# EasyEDA Pro project board.epro, schematic 黄山派核心板_SCH_V1.2

## Sheets
1 SF32LB52-MOD-1: Board Name: 核心板; Create Date: 2025-04-18; Page Name: SF32LB52-MOD-1; Project Name: 立创·黄山派SF32LB52开发板V1.3（202504182008）; Schematic Name: 黄山派核心板_SCH_V1.3; Update Date: 2025-04-18; Company: 嘉立创EDA; Page Size: A3; Version: V1.0
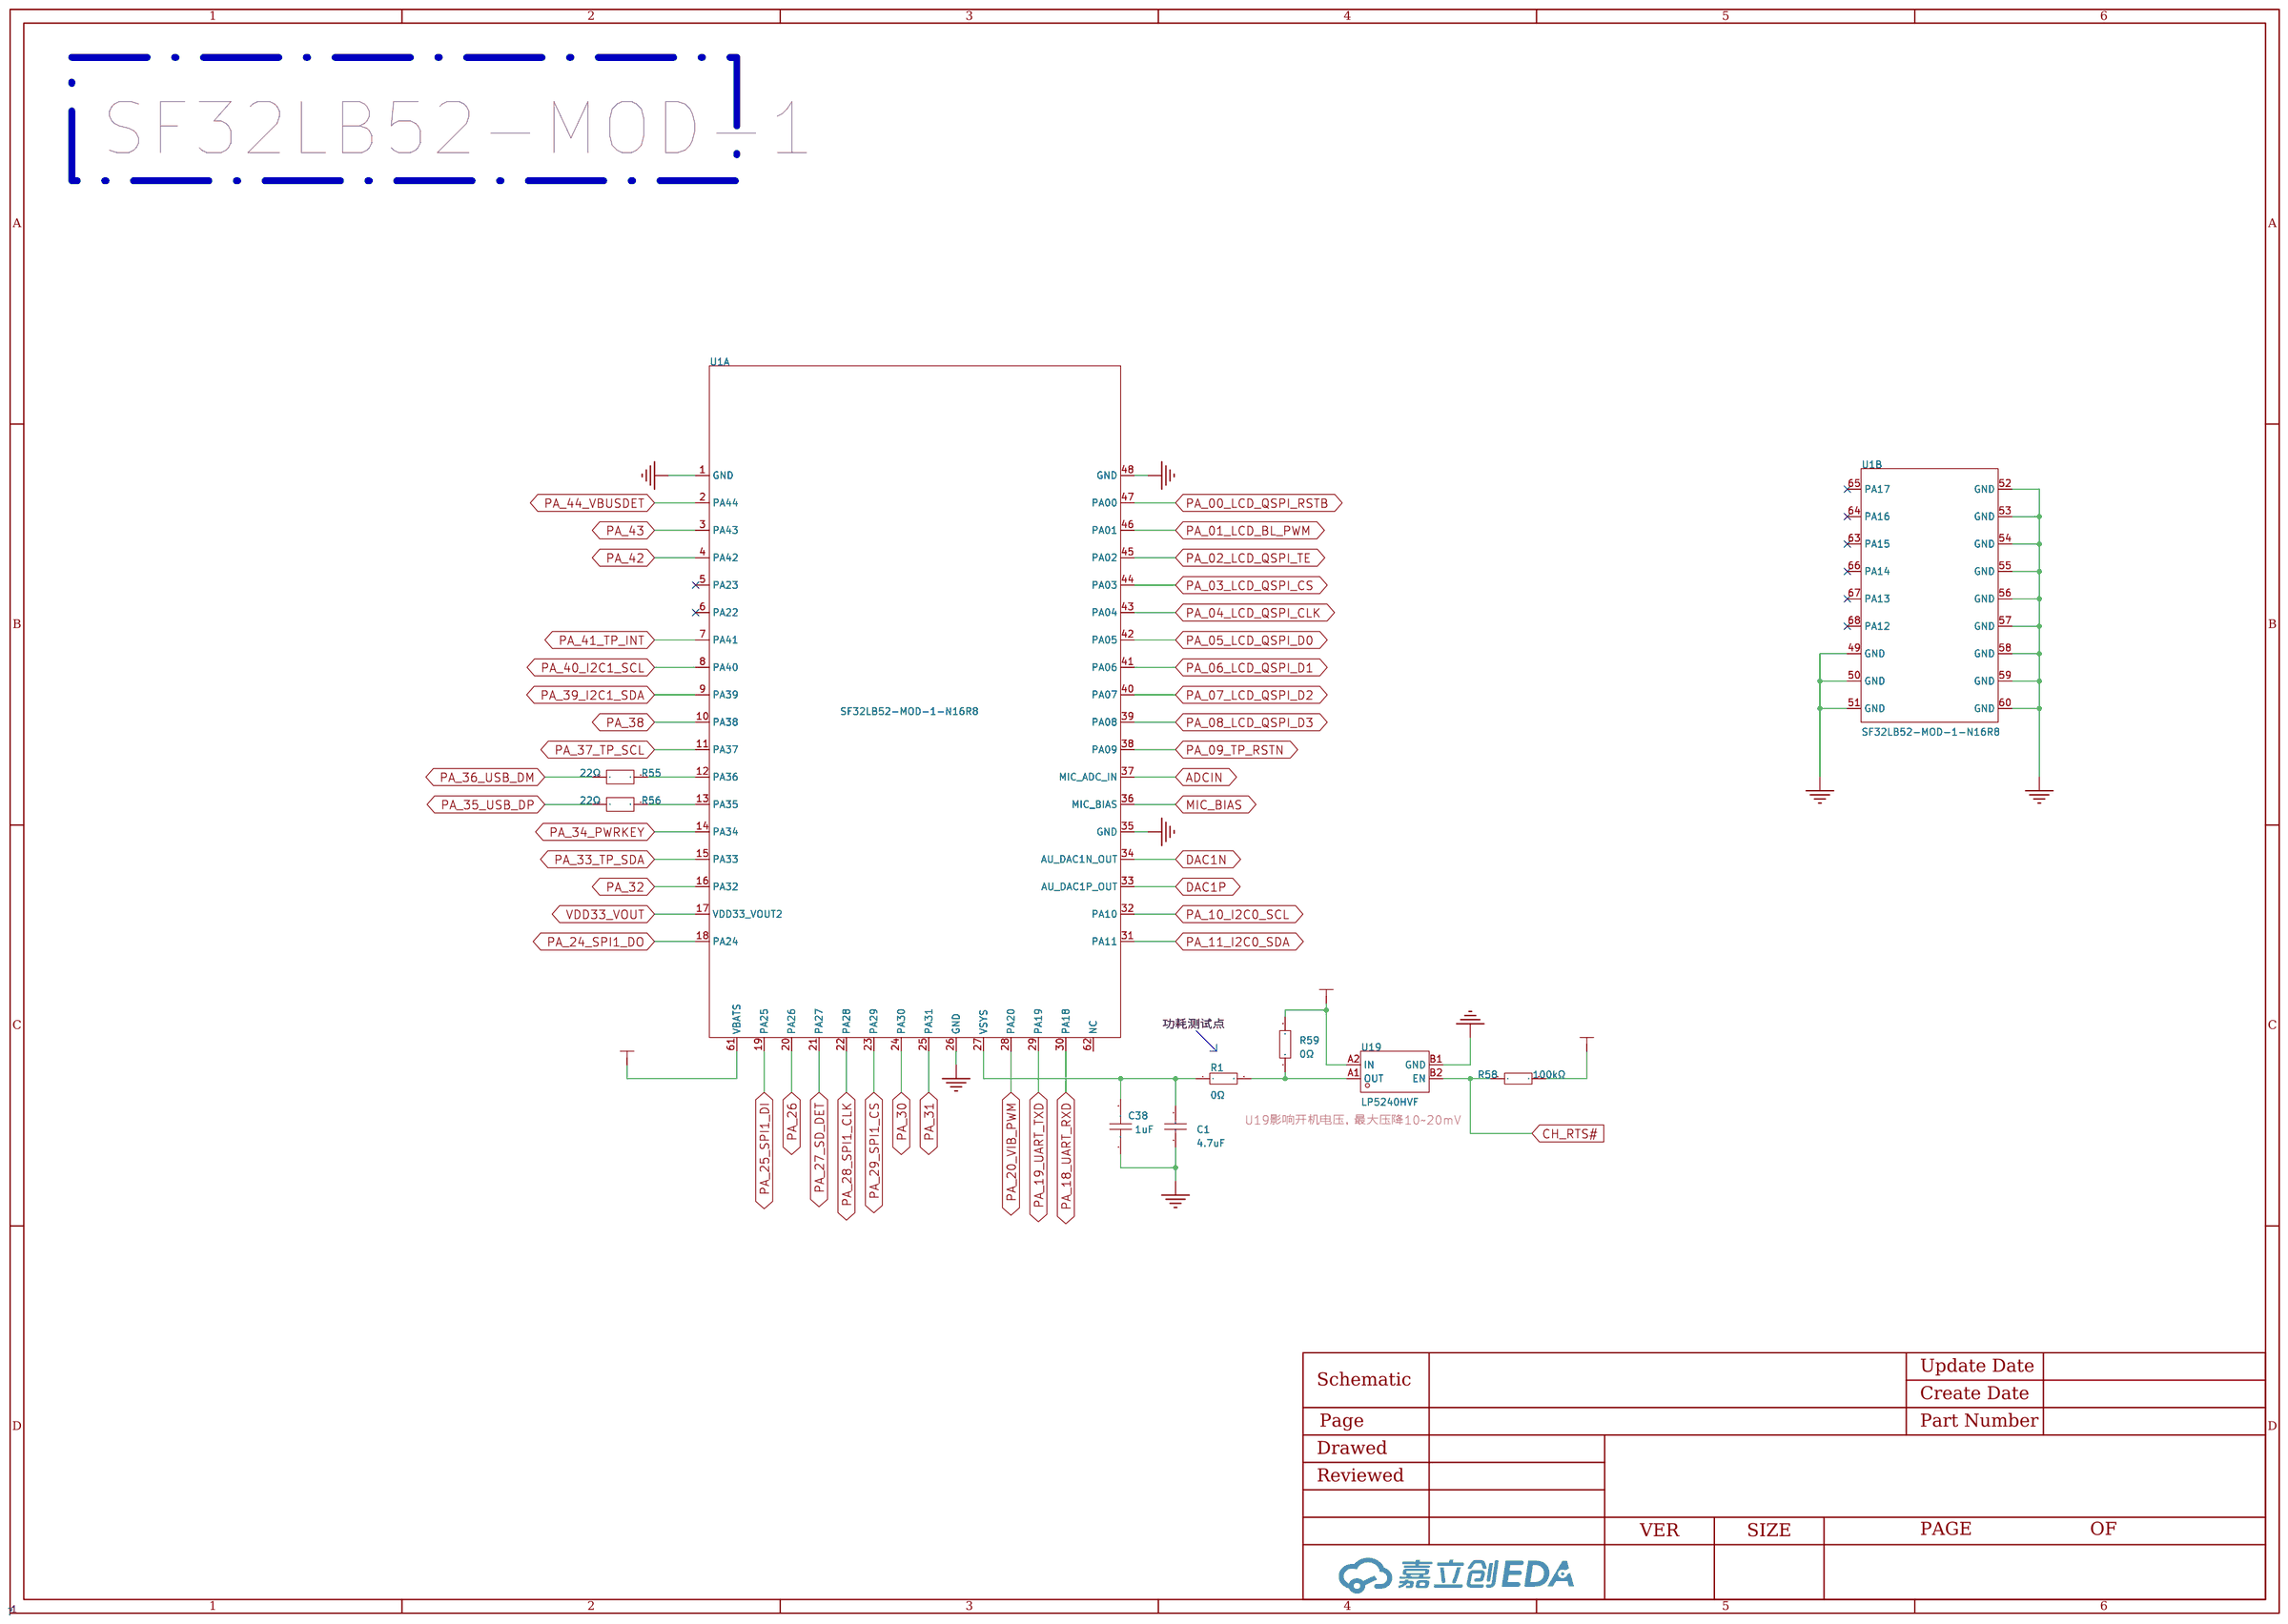
[diagram p1: SF32LB52-MOD-1]
2 GPIO: Create Date: 2025-03-31; Page Name: GPIO; Project Name: 立创·黄山派SF32LB52-MOD-1开发板-V110（202503311004）; Schematic Name: 黄山派核心板_SCH_V110; Update Date: 2025-04-17; Page Size: A4
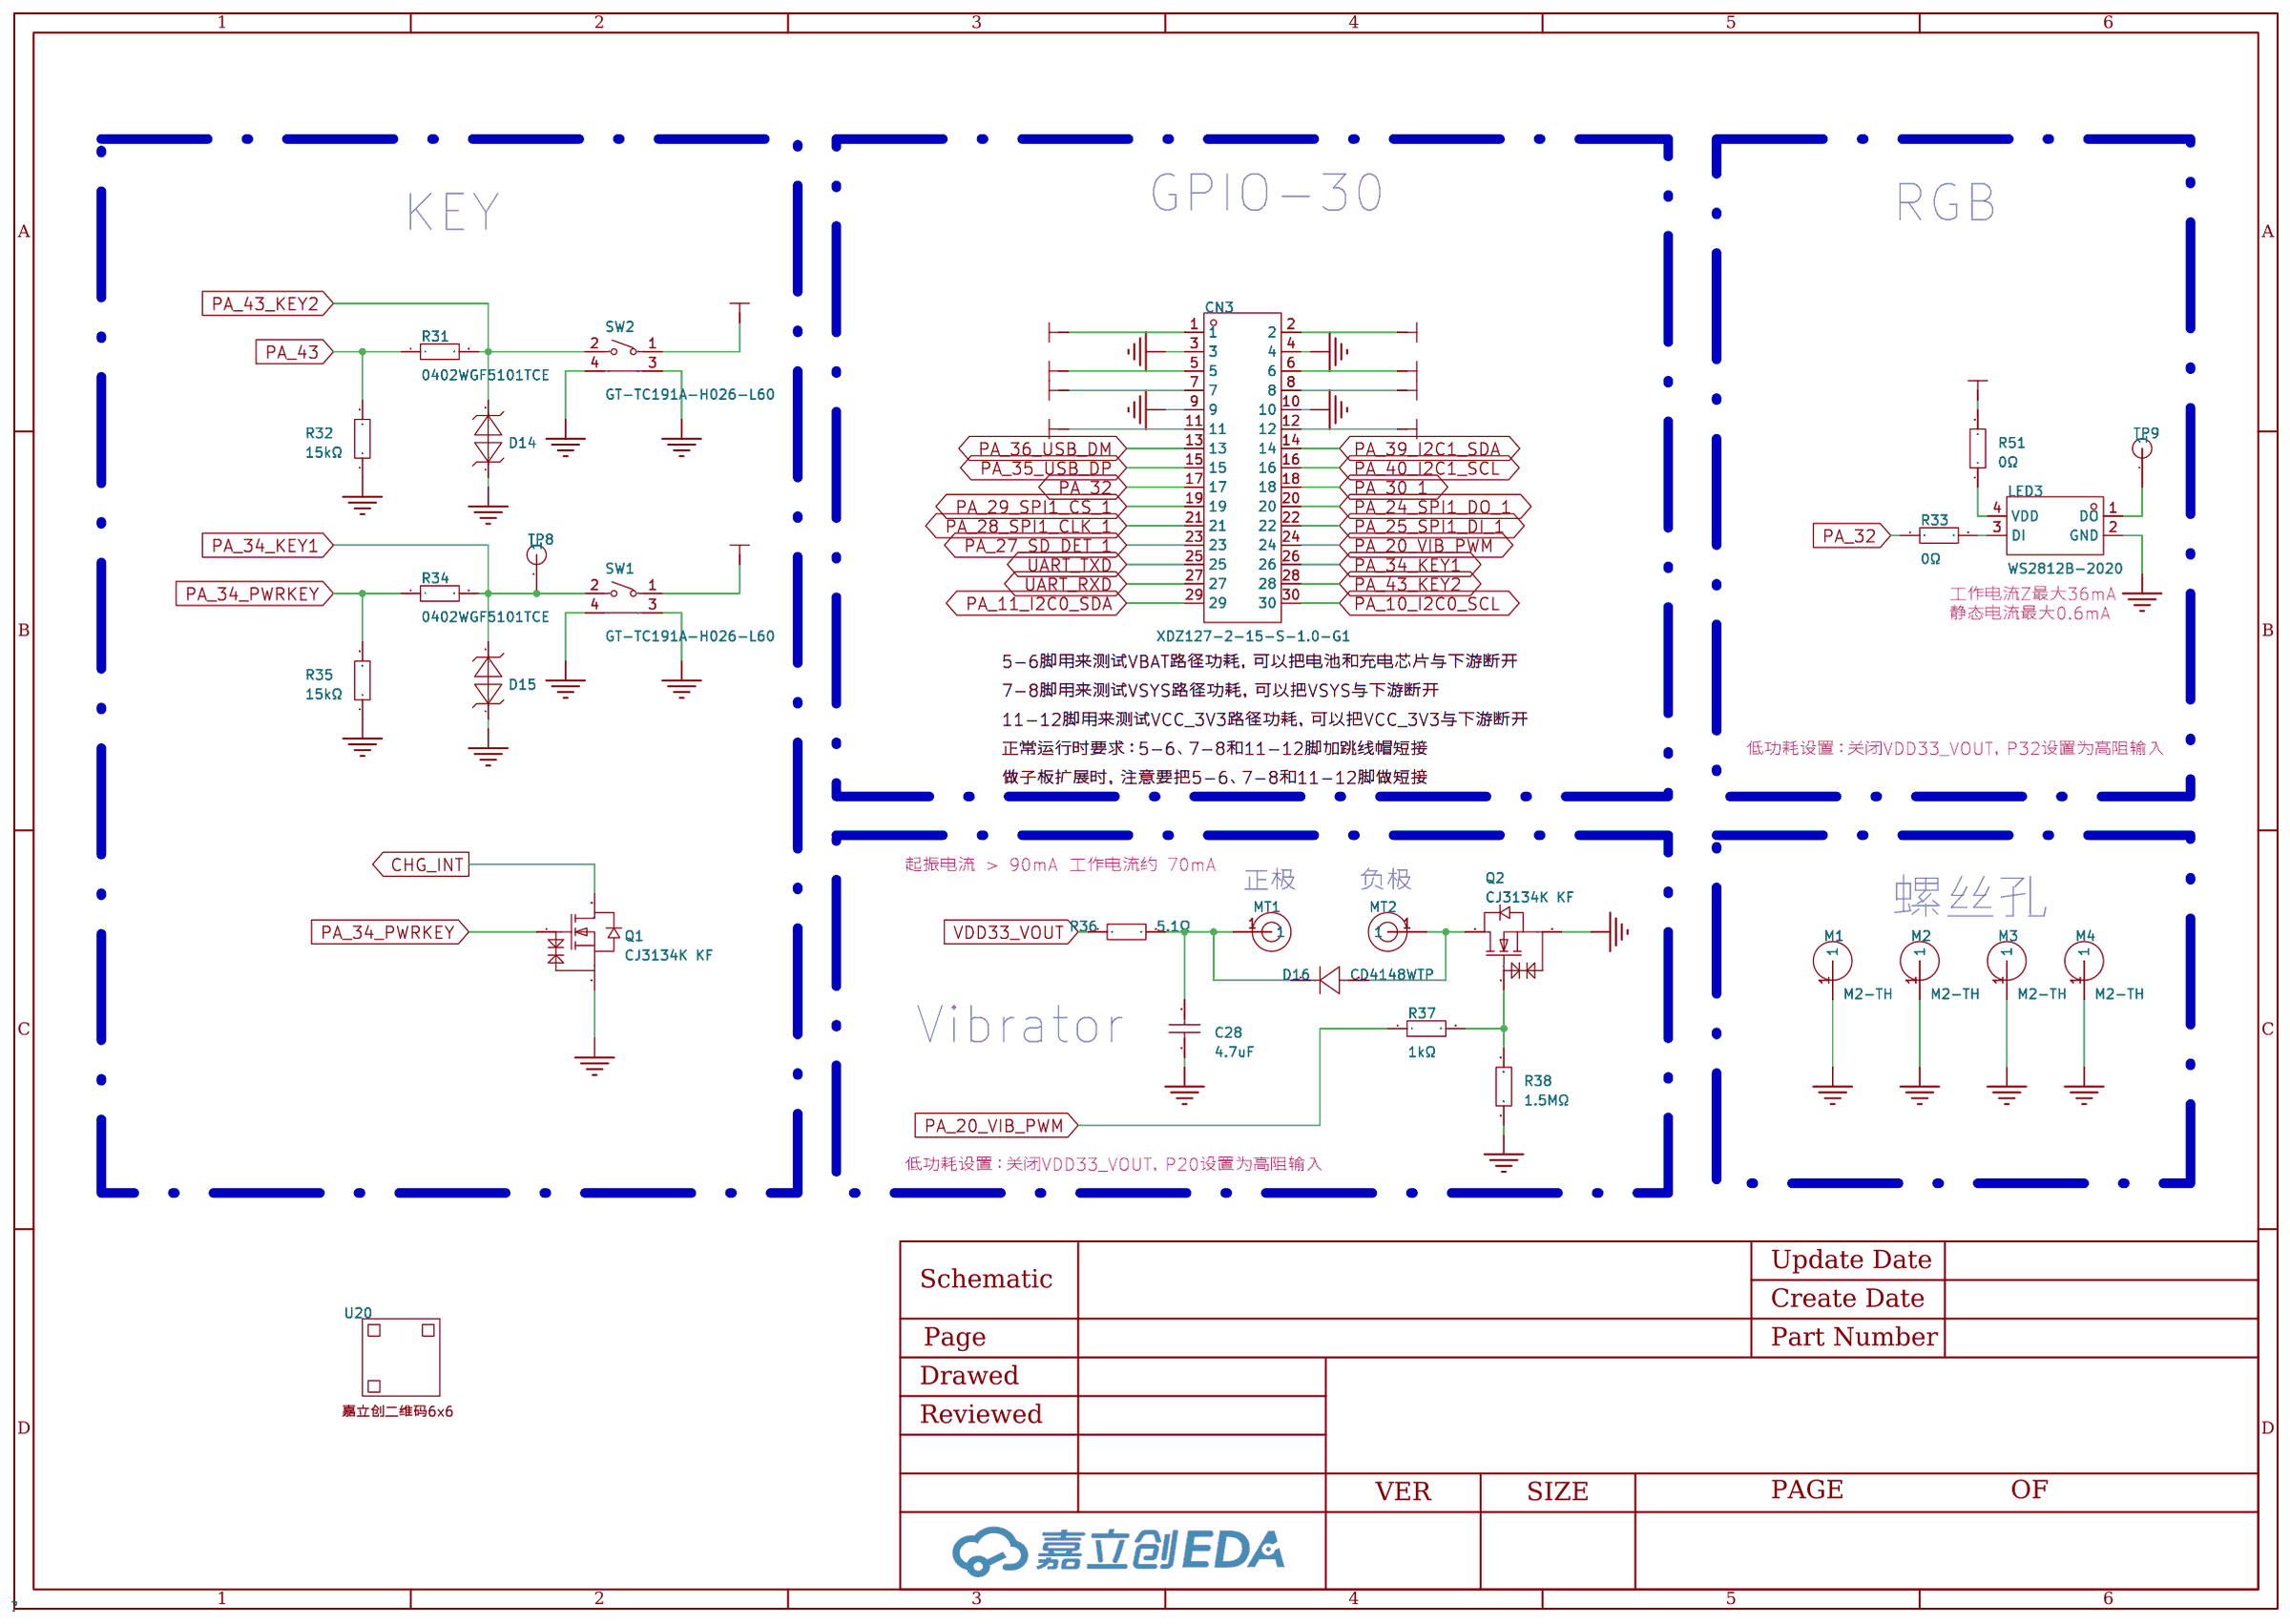
[diagram p2: GPIO]
3 MicroSD_Card: Create Date: 2025-03-31; Page Name: MicroSD_Card; Project Name: 立创·黄山派SF32LB52-MOD-1开发板-V110（202503311004）; Schematic Name: 黄山派核心板_SCH_V110; Update Date: 2025-03-31; Page Size: A4
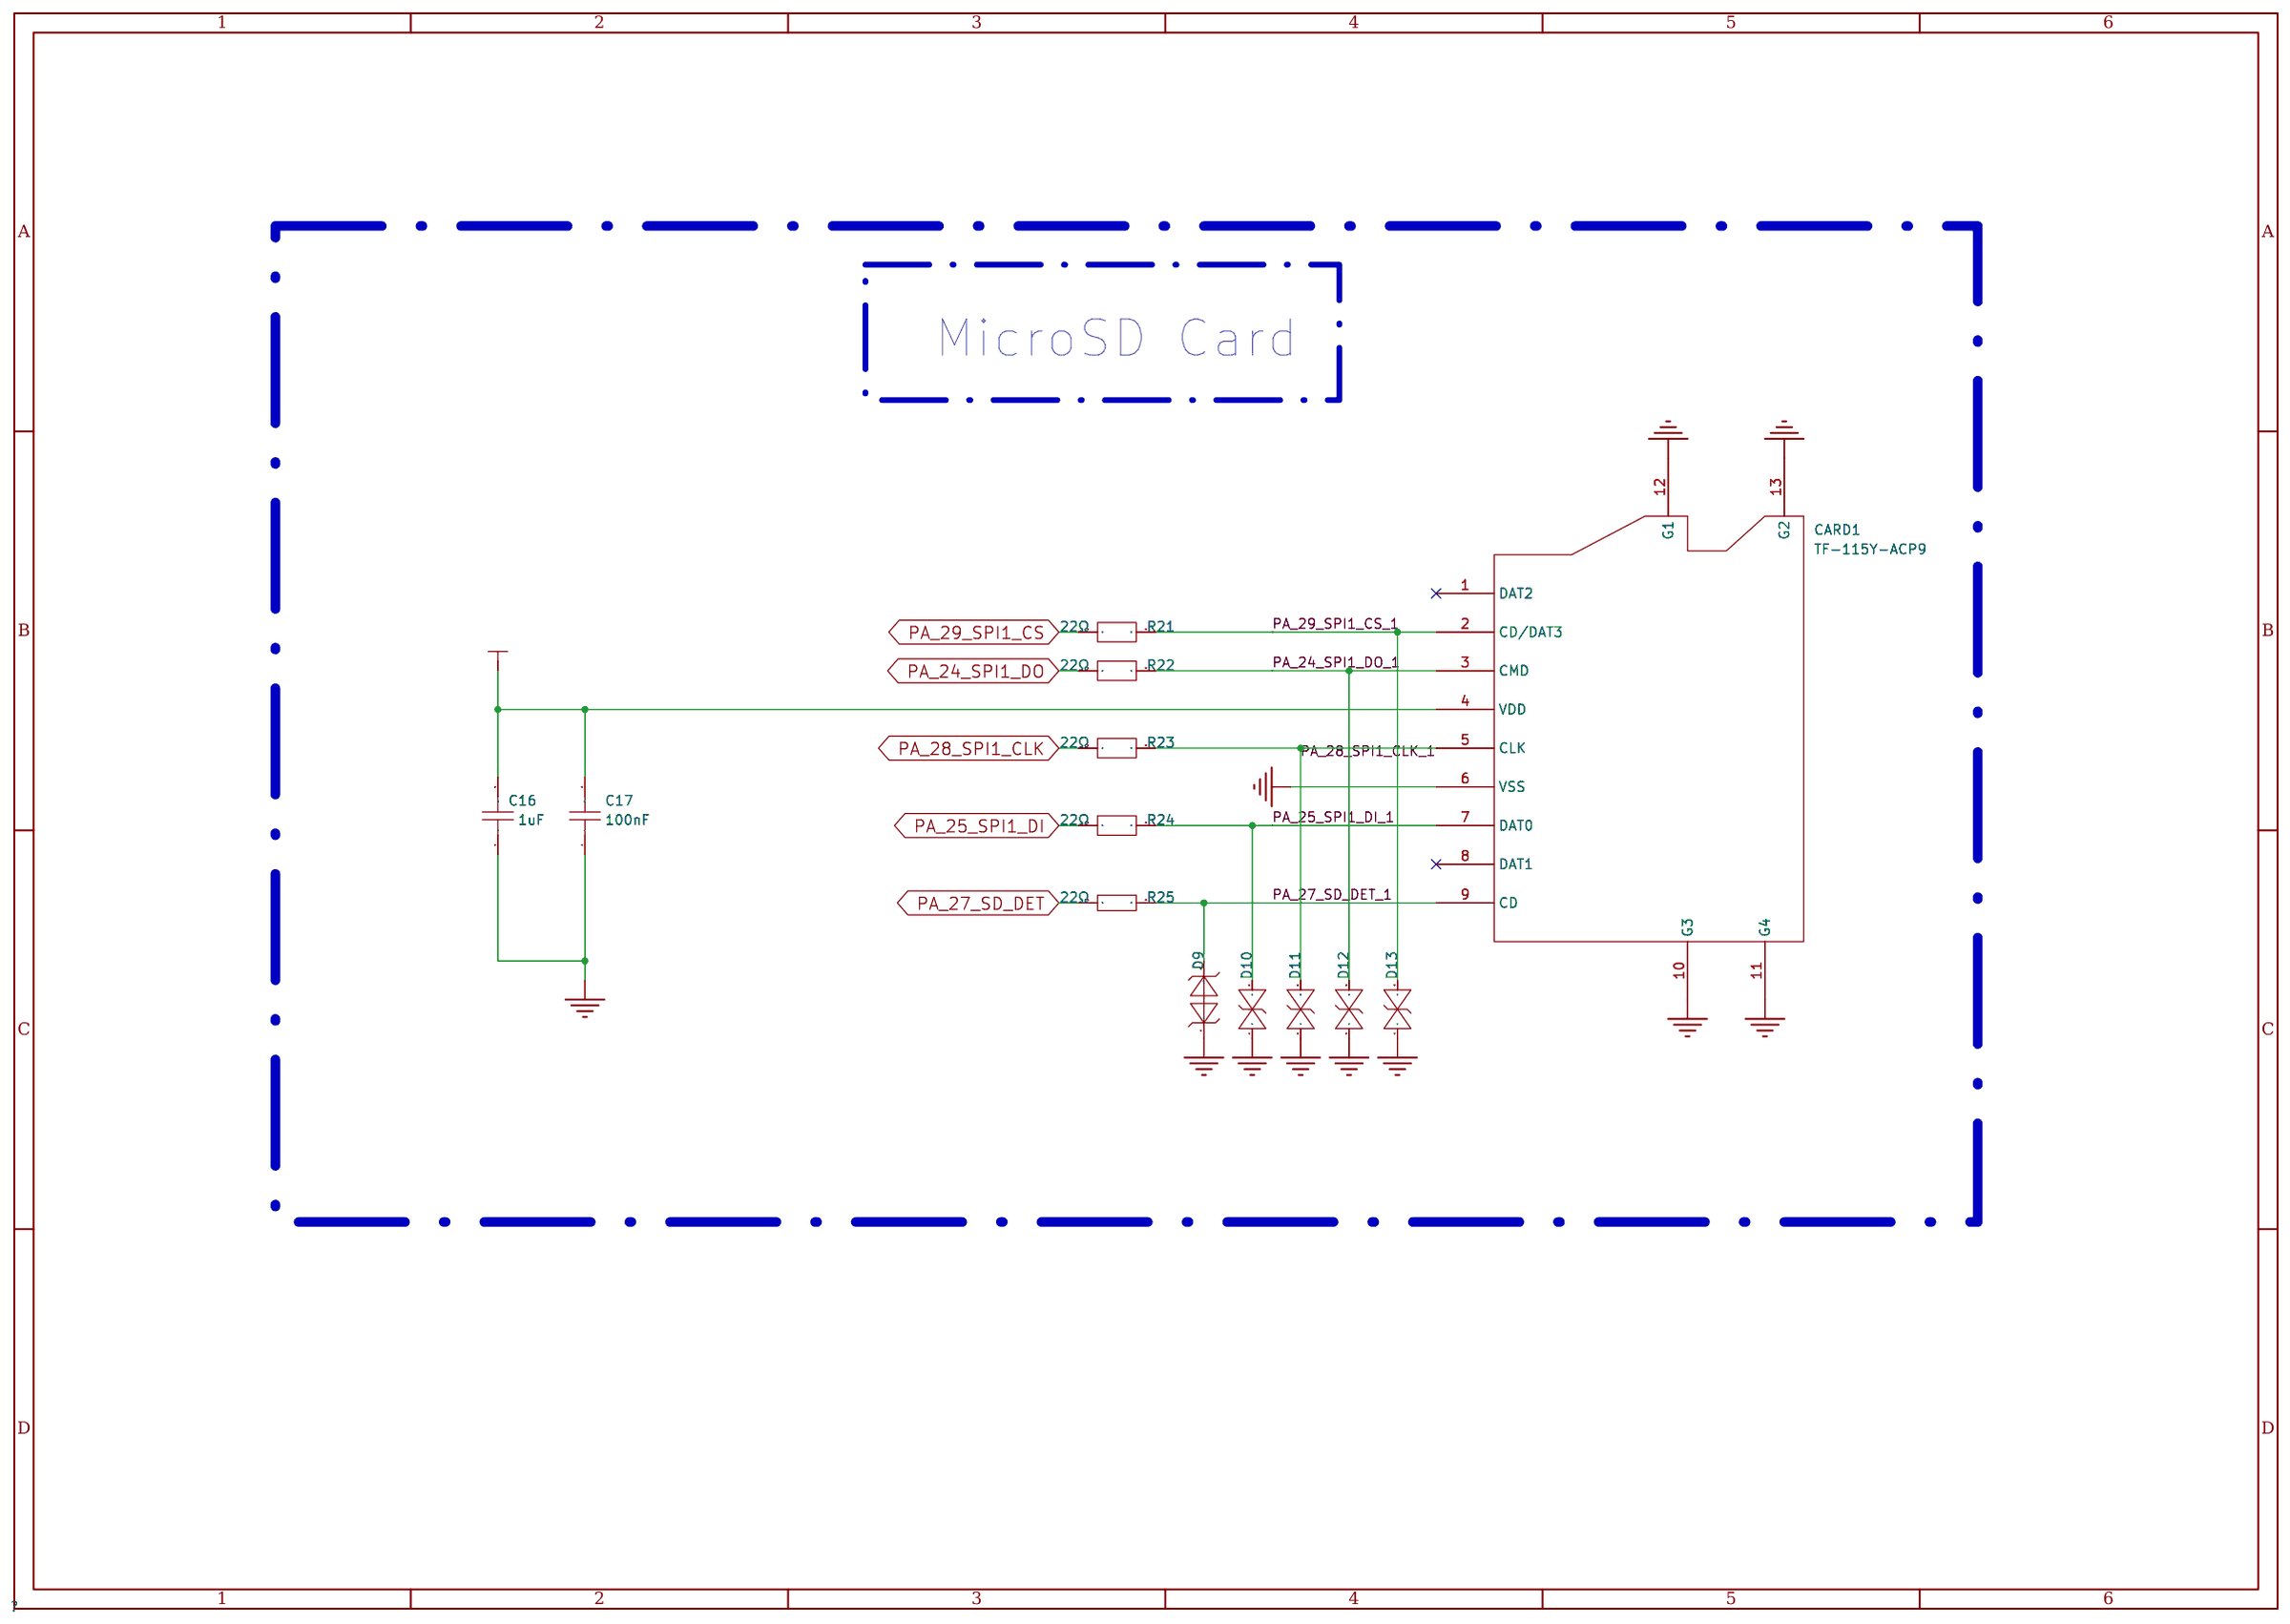
[diagram p3: MicroSD_Card]
4 LCM_QSPI AND TP: Page Name: LCM_QSPI AND TP; Page Size: A4
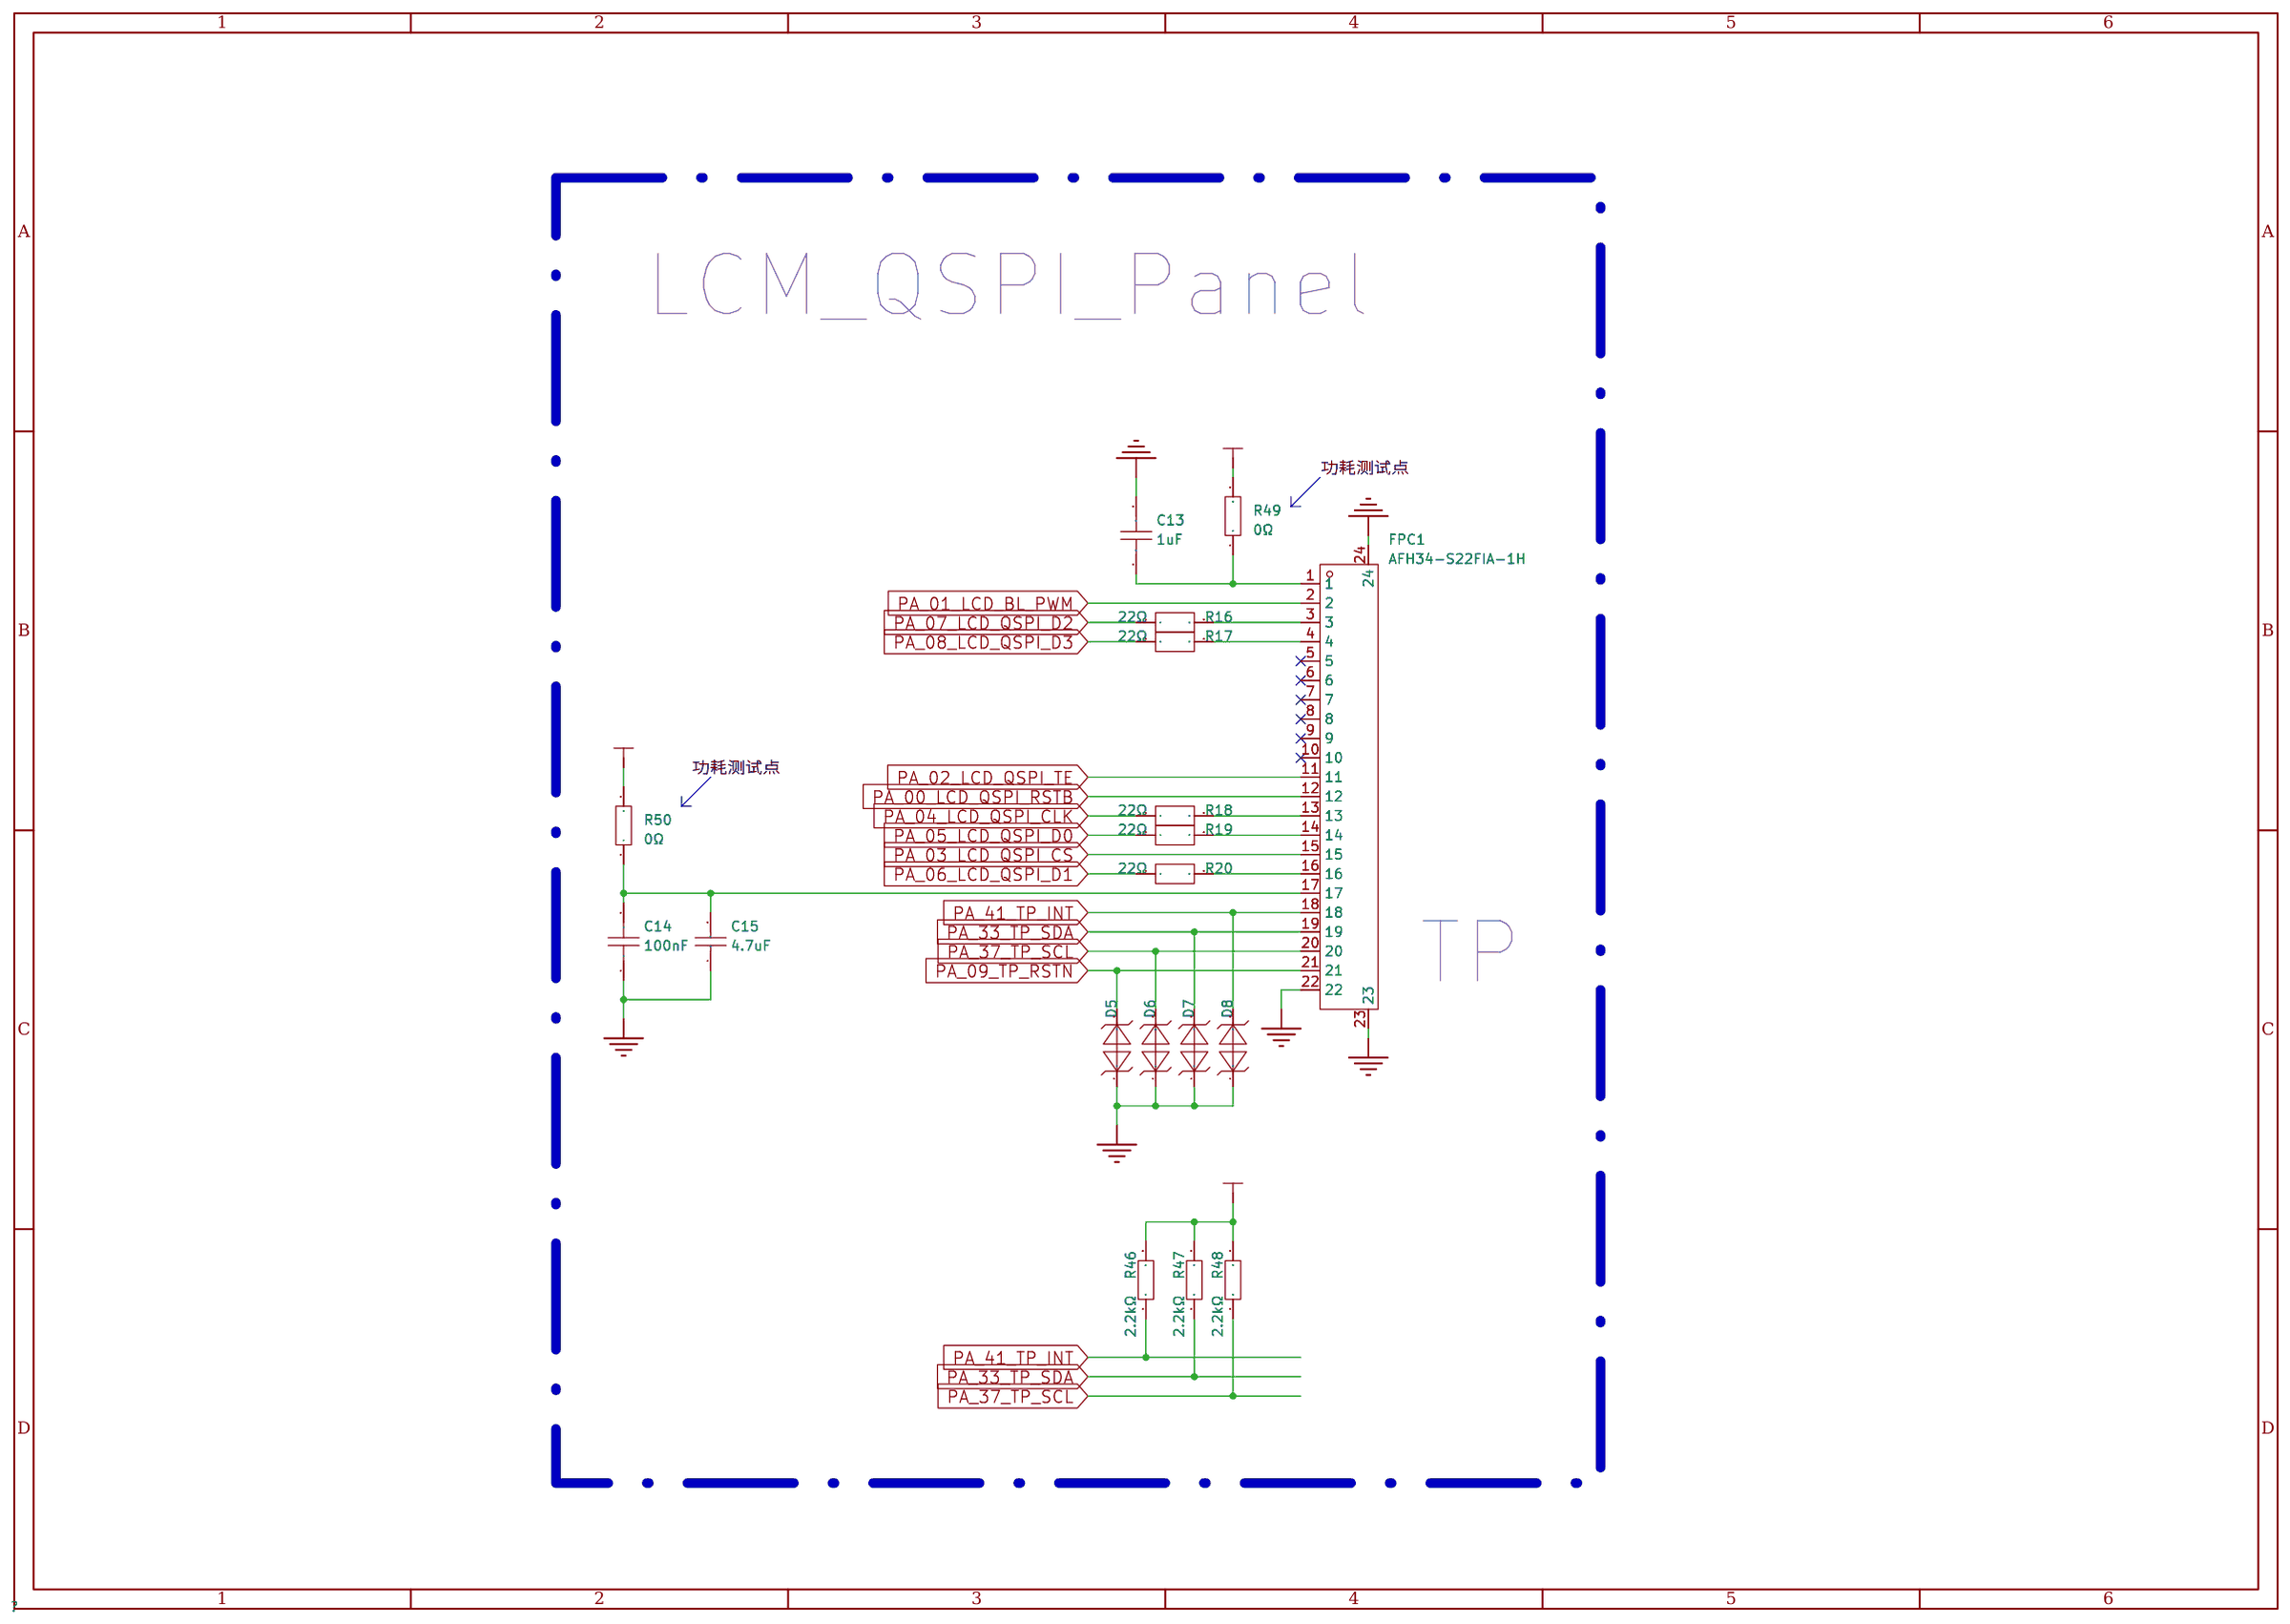
[diagram p4: LCM_QSPI AND TP]
5 DEBUG: Create Date: 2025-03-31; Page Name: DEBUG; Project Name: 立创·黄山派SF32LB52-MOD-1开发板-V110（202503311004）; Schematic Name: 黄山派核心板_SCH_V110; Update Date: 2025-03-31; Page Size: A4
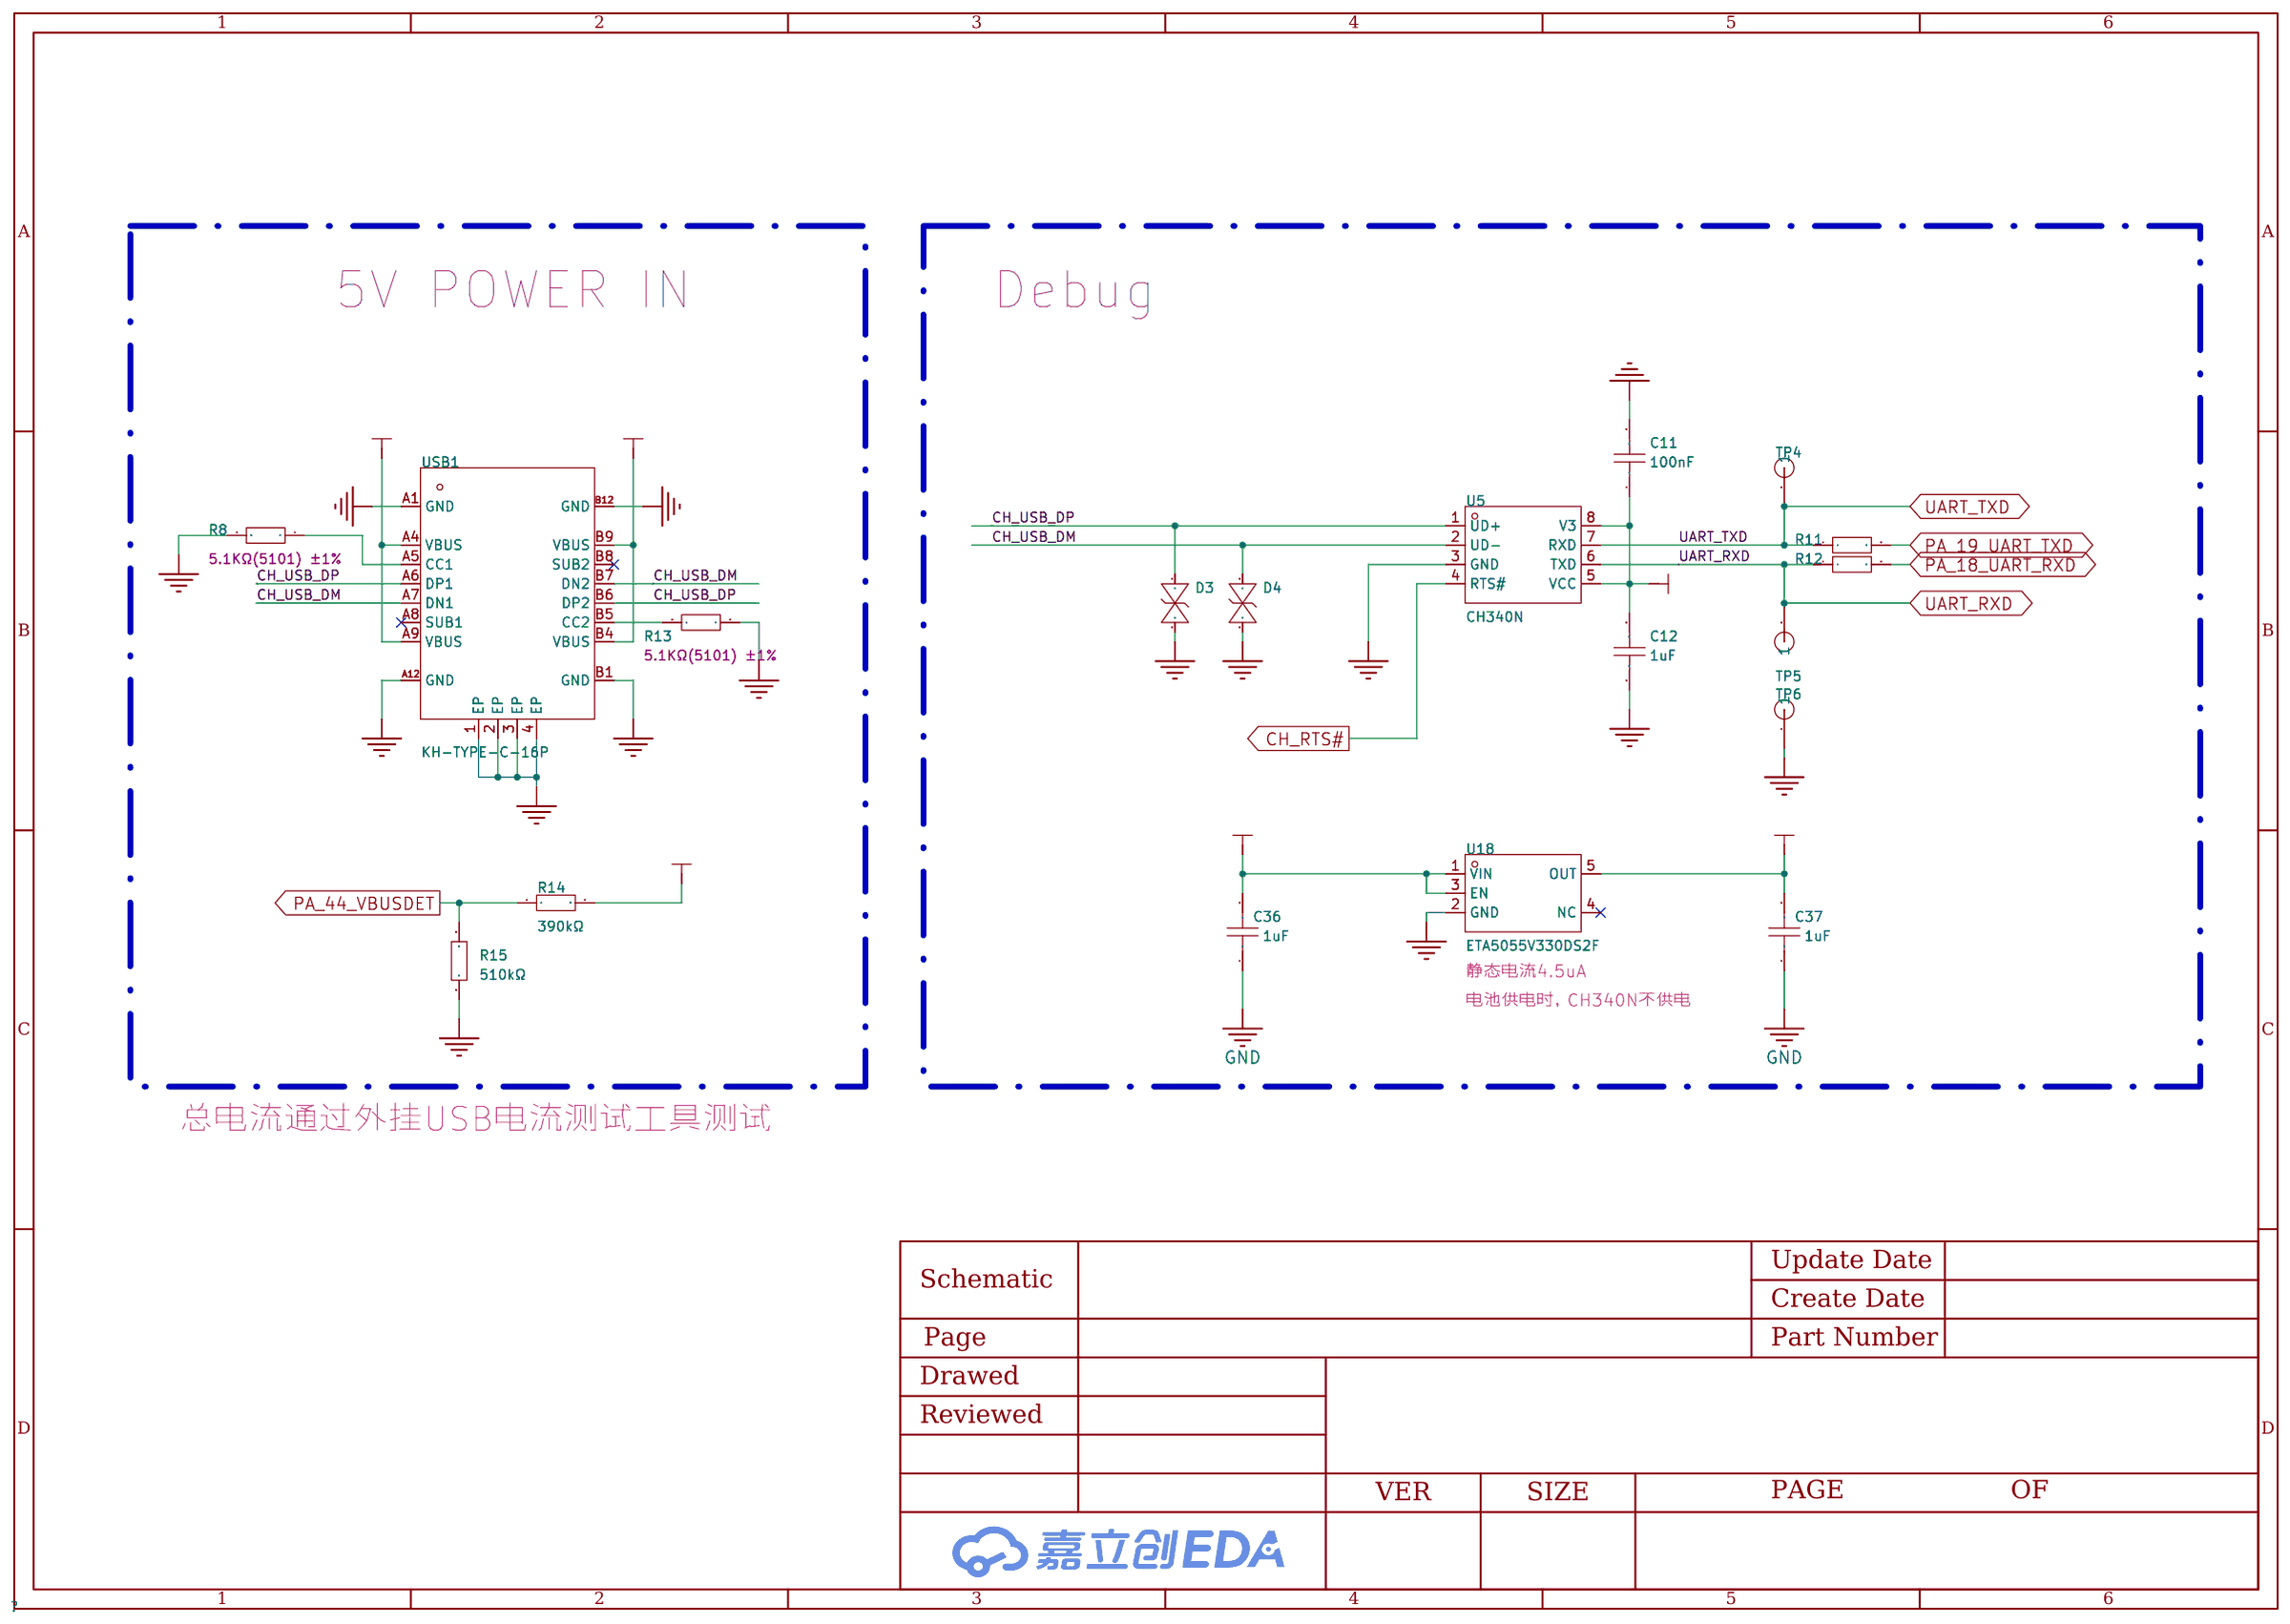
[diagram p5: DEBUG]
6 AUDIO: Page Name: AUDIO; Project Name: 立创·黄山派SF32LB52开发板V1.2（202504231031）; Update Date: 2025-04-23; Page Size: A4
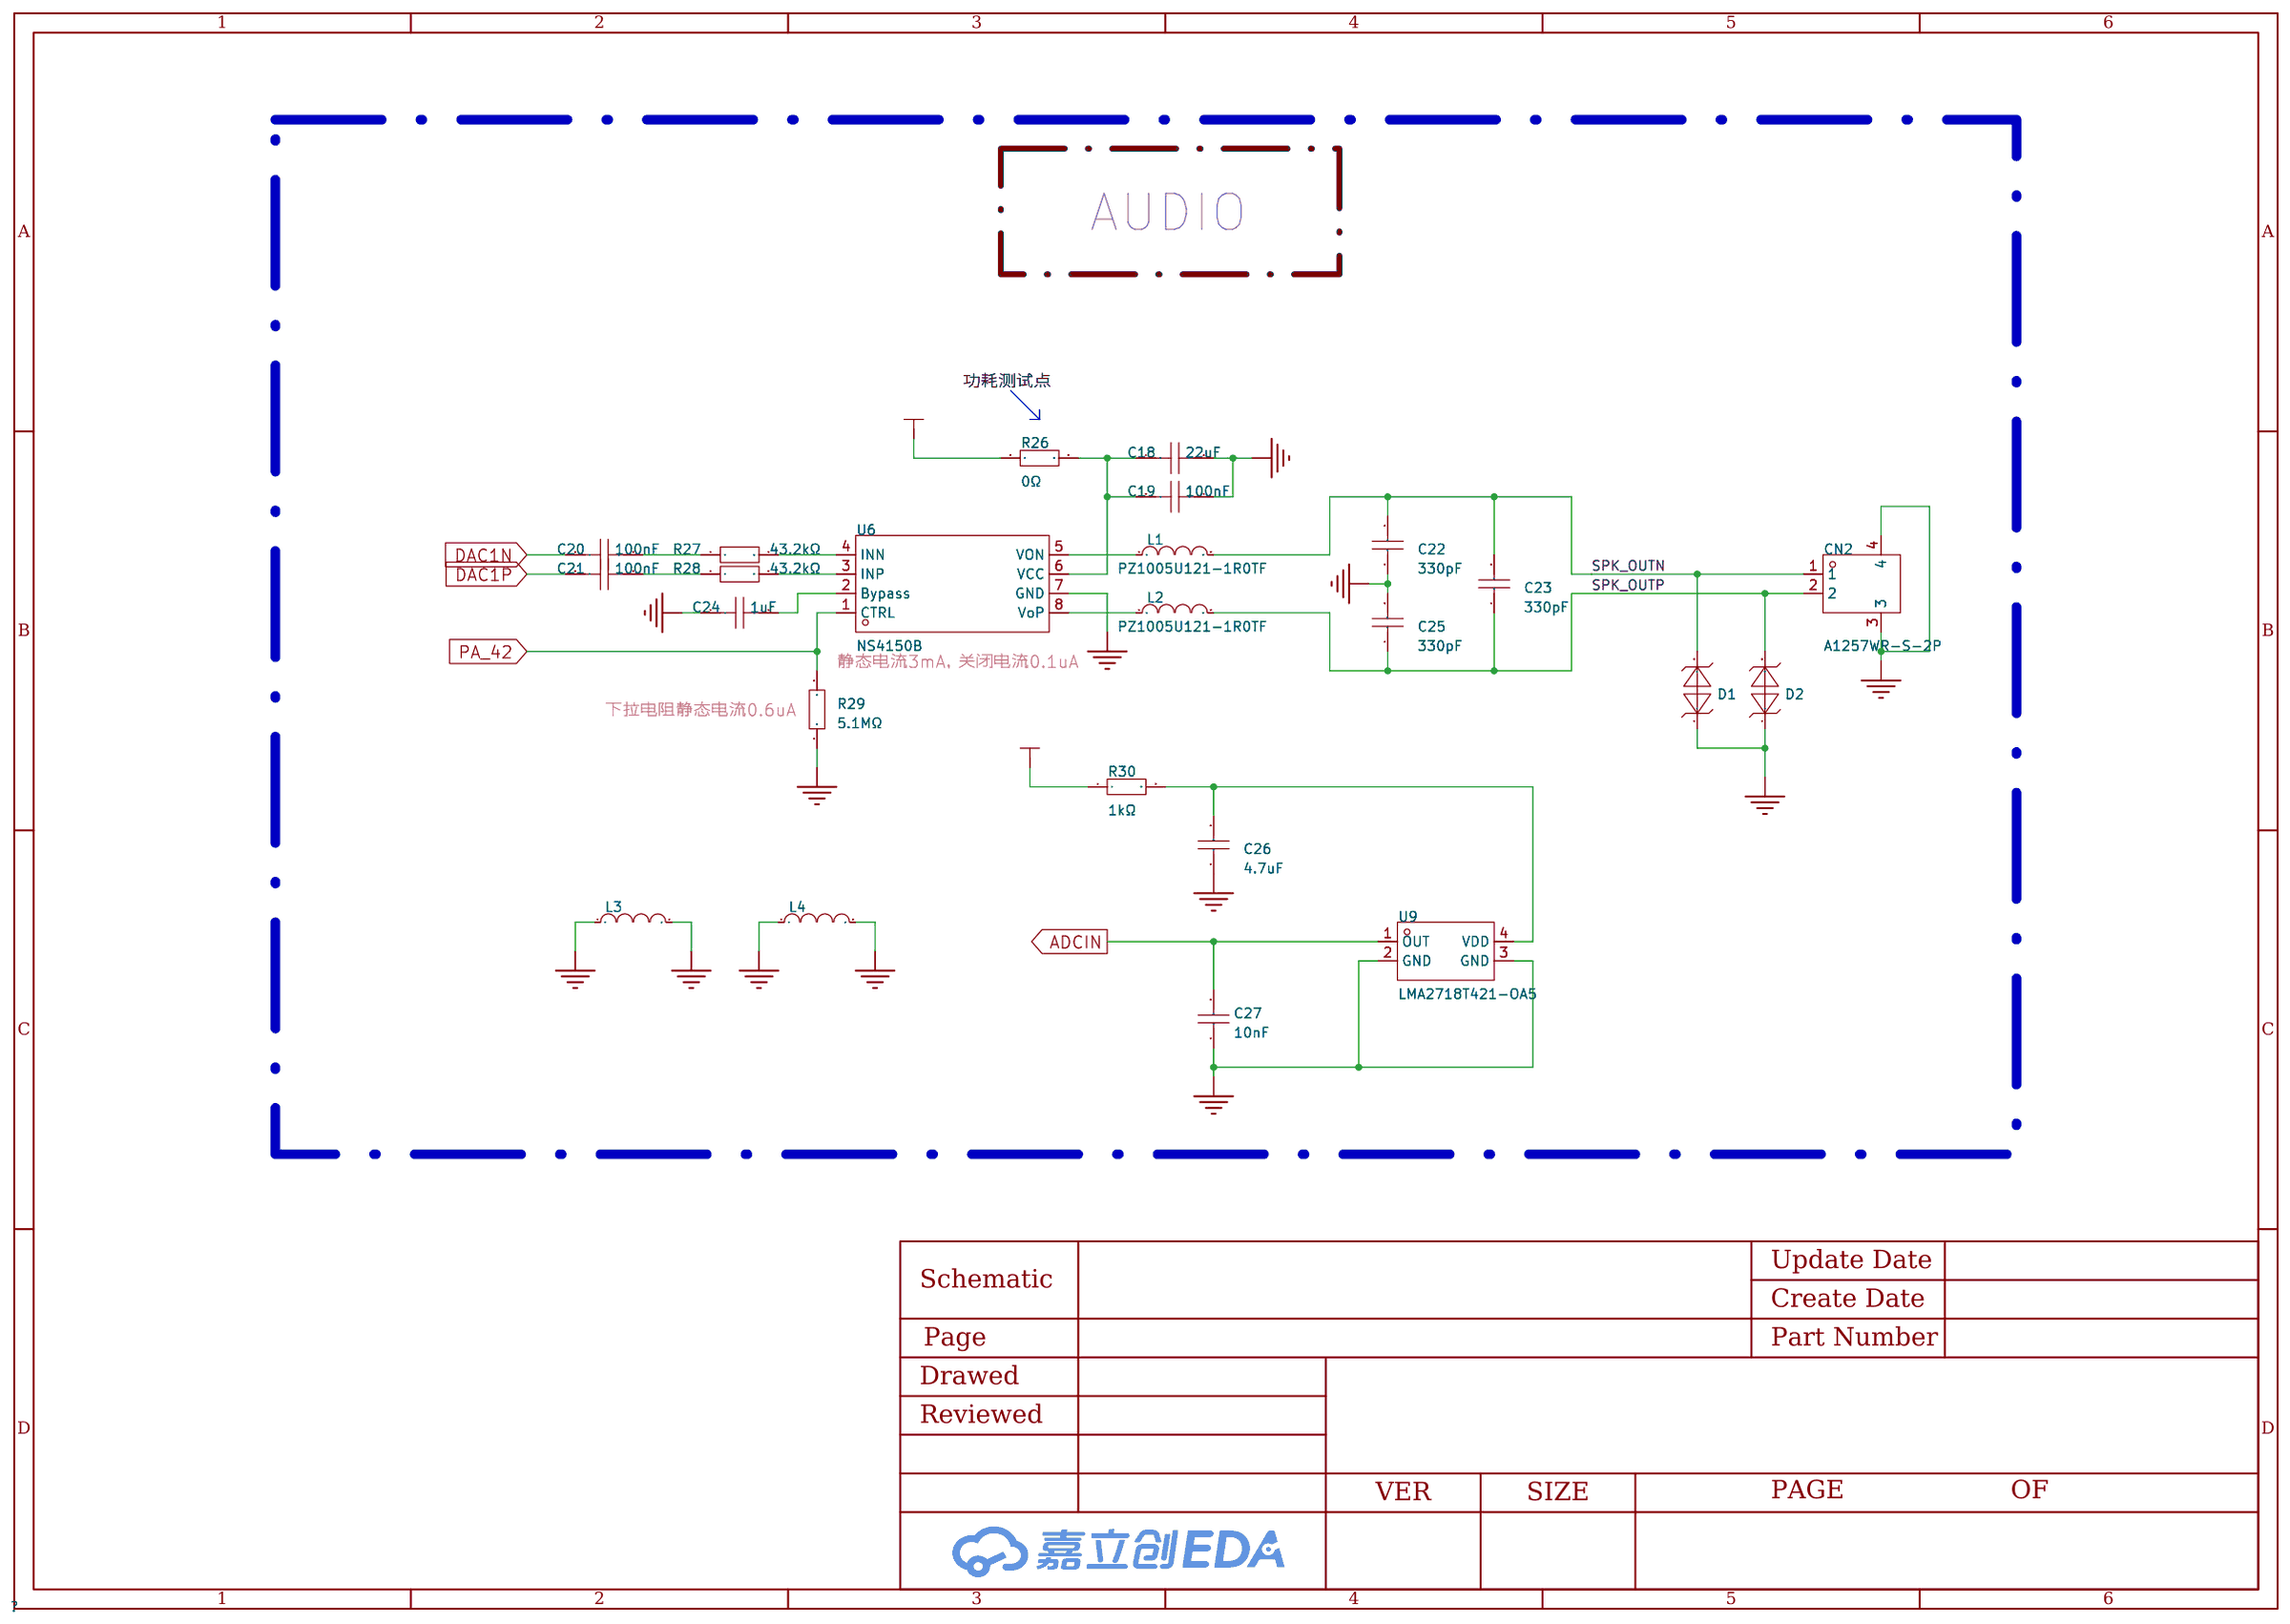
[diagram p6: AUDIO]
7 POWER: Create Date: 2025-04-24; Page Name: POWER; Project Name: 立创·黄山派SF32LB52开发板V1.2（202504250924）; Schematic Name: 黄山派核心板_SCH_V1.2; Update Date: 2025-04-24; Page Size: A4
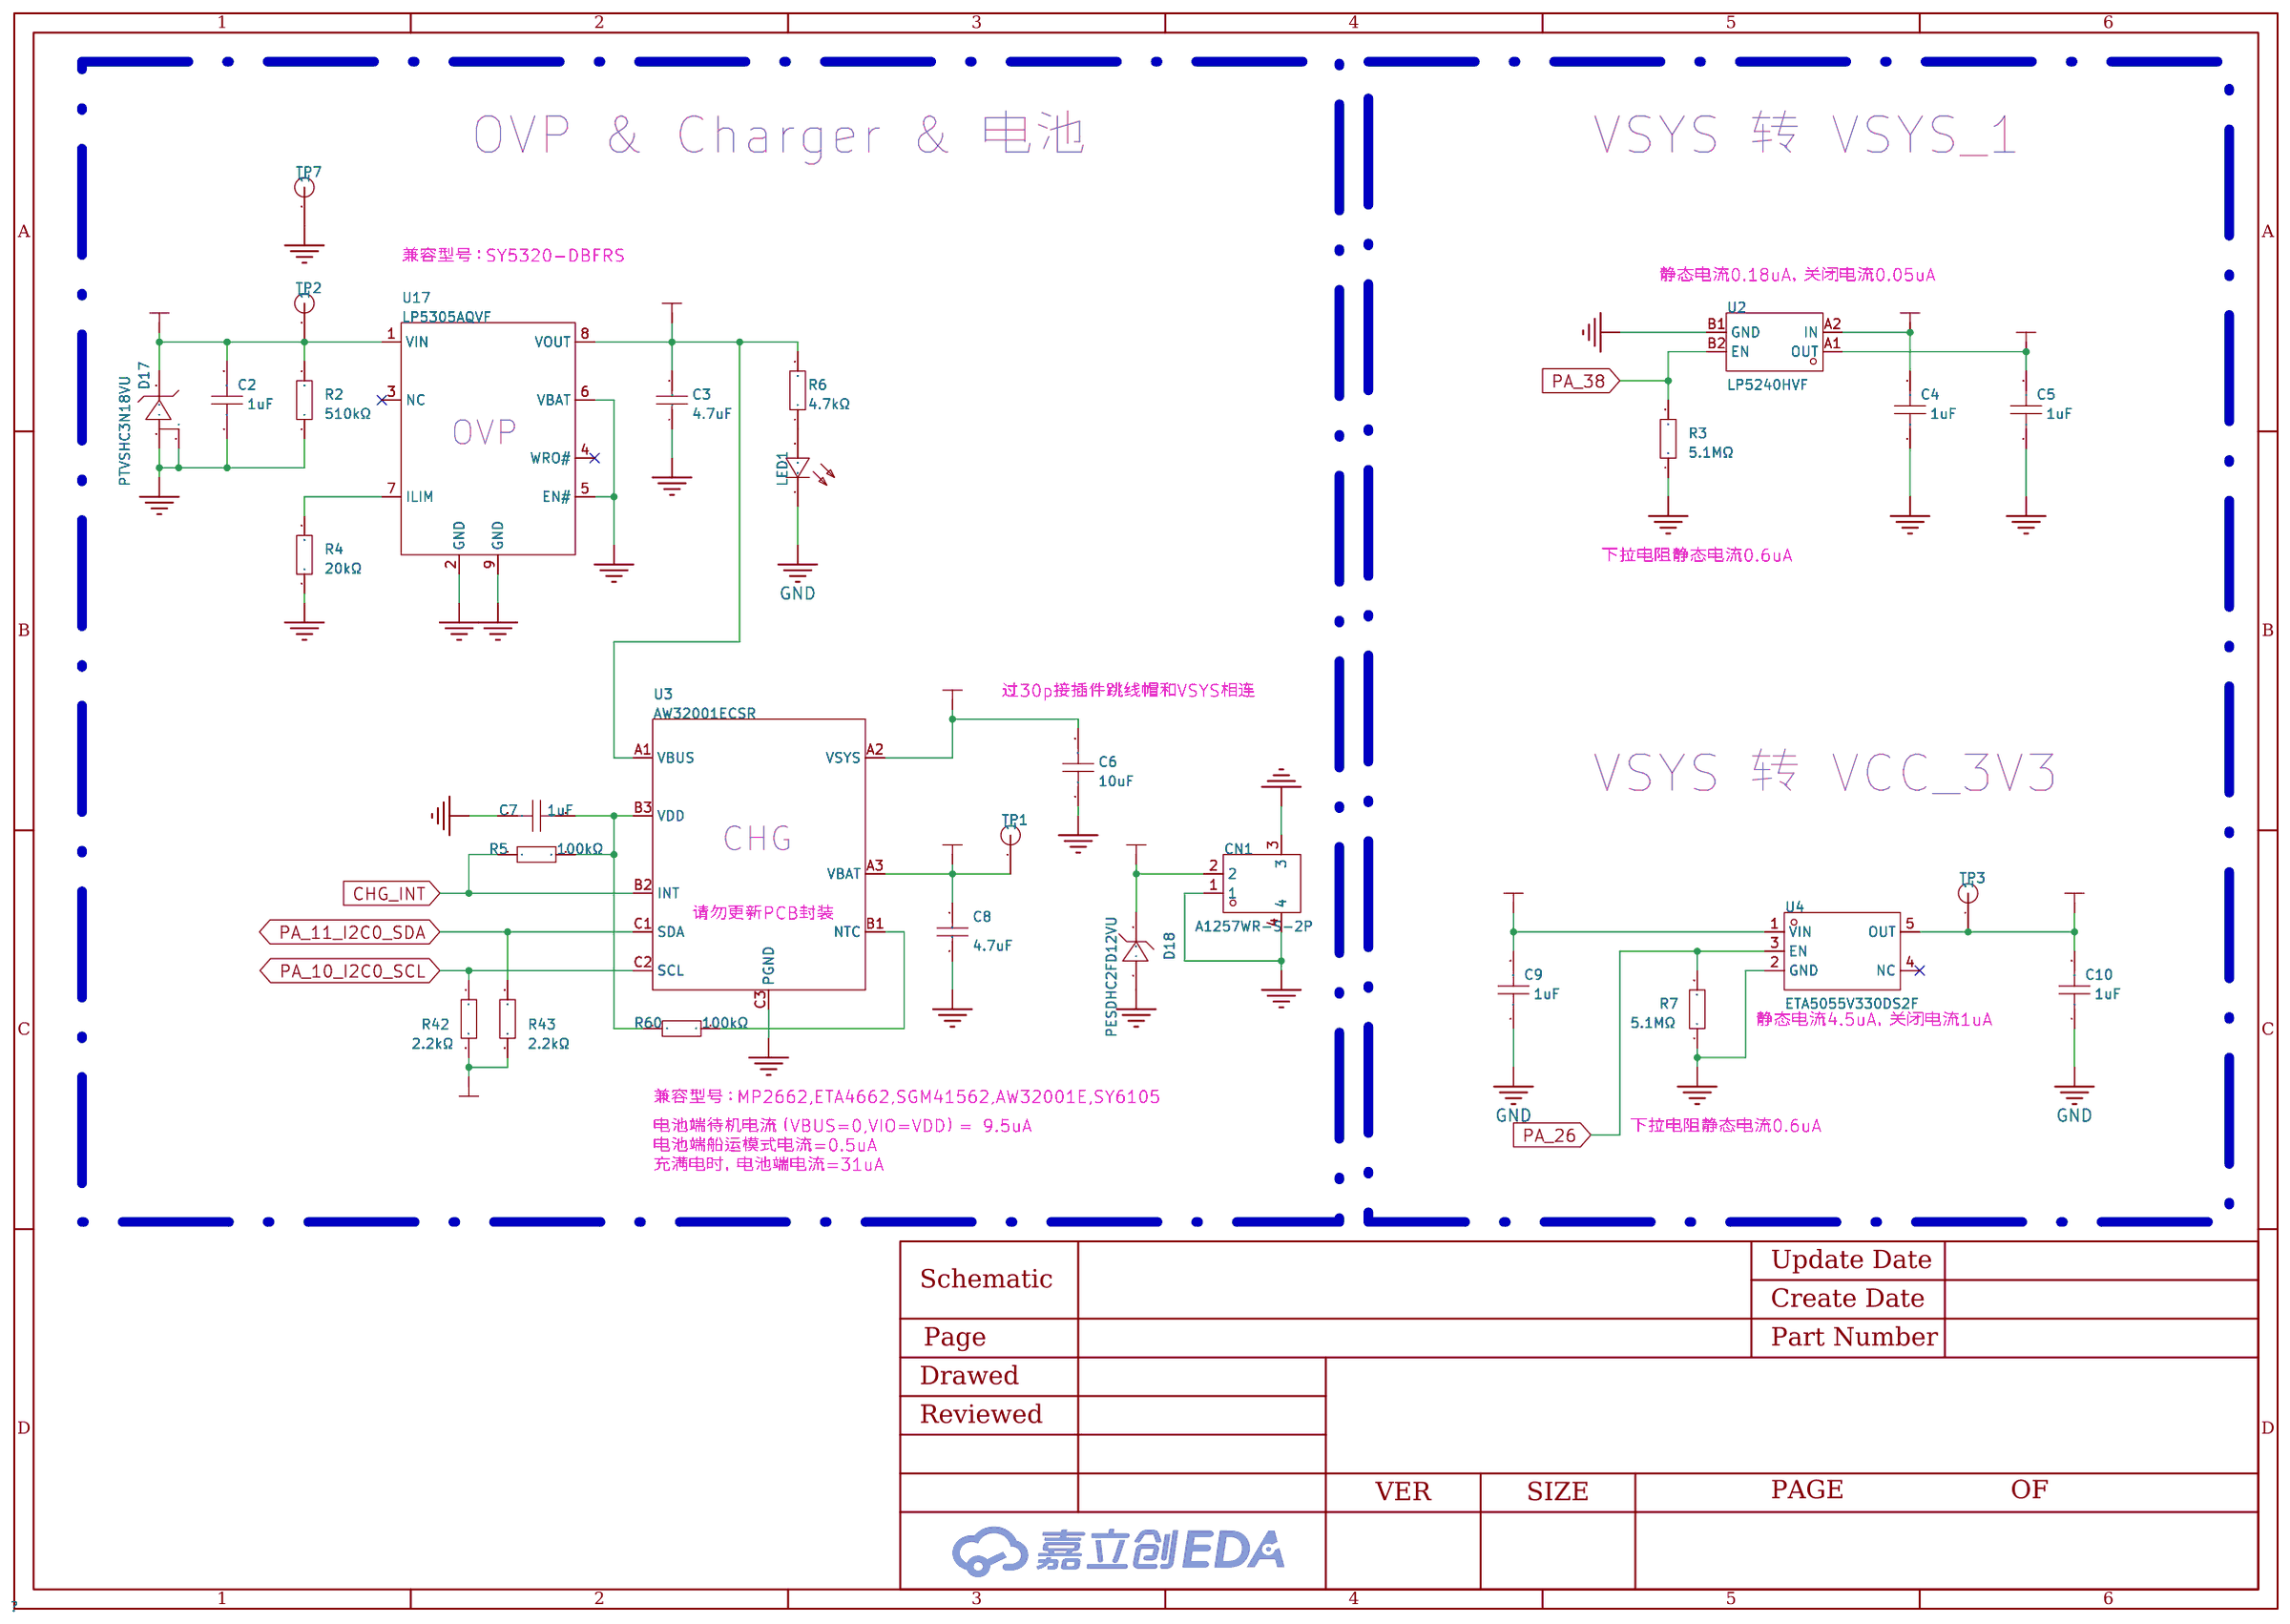
[diagram p7: POWER]
8 Sensor: Create Date: 2025-03-31; Page Name: Sensor; Project Name: 立创·黄山派SF32LB52-MOD-1开发板-V110（202503311004）; Schematic Name: 黄山派核心板_SCH_V110; Update Date: 2025-03-31; Page Size: A4
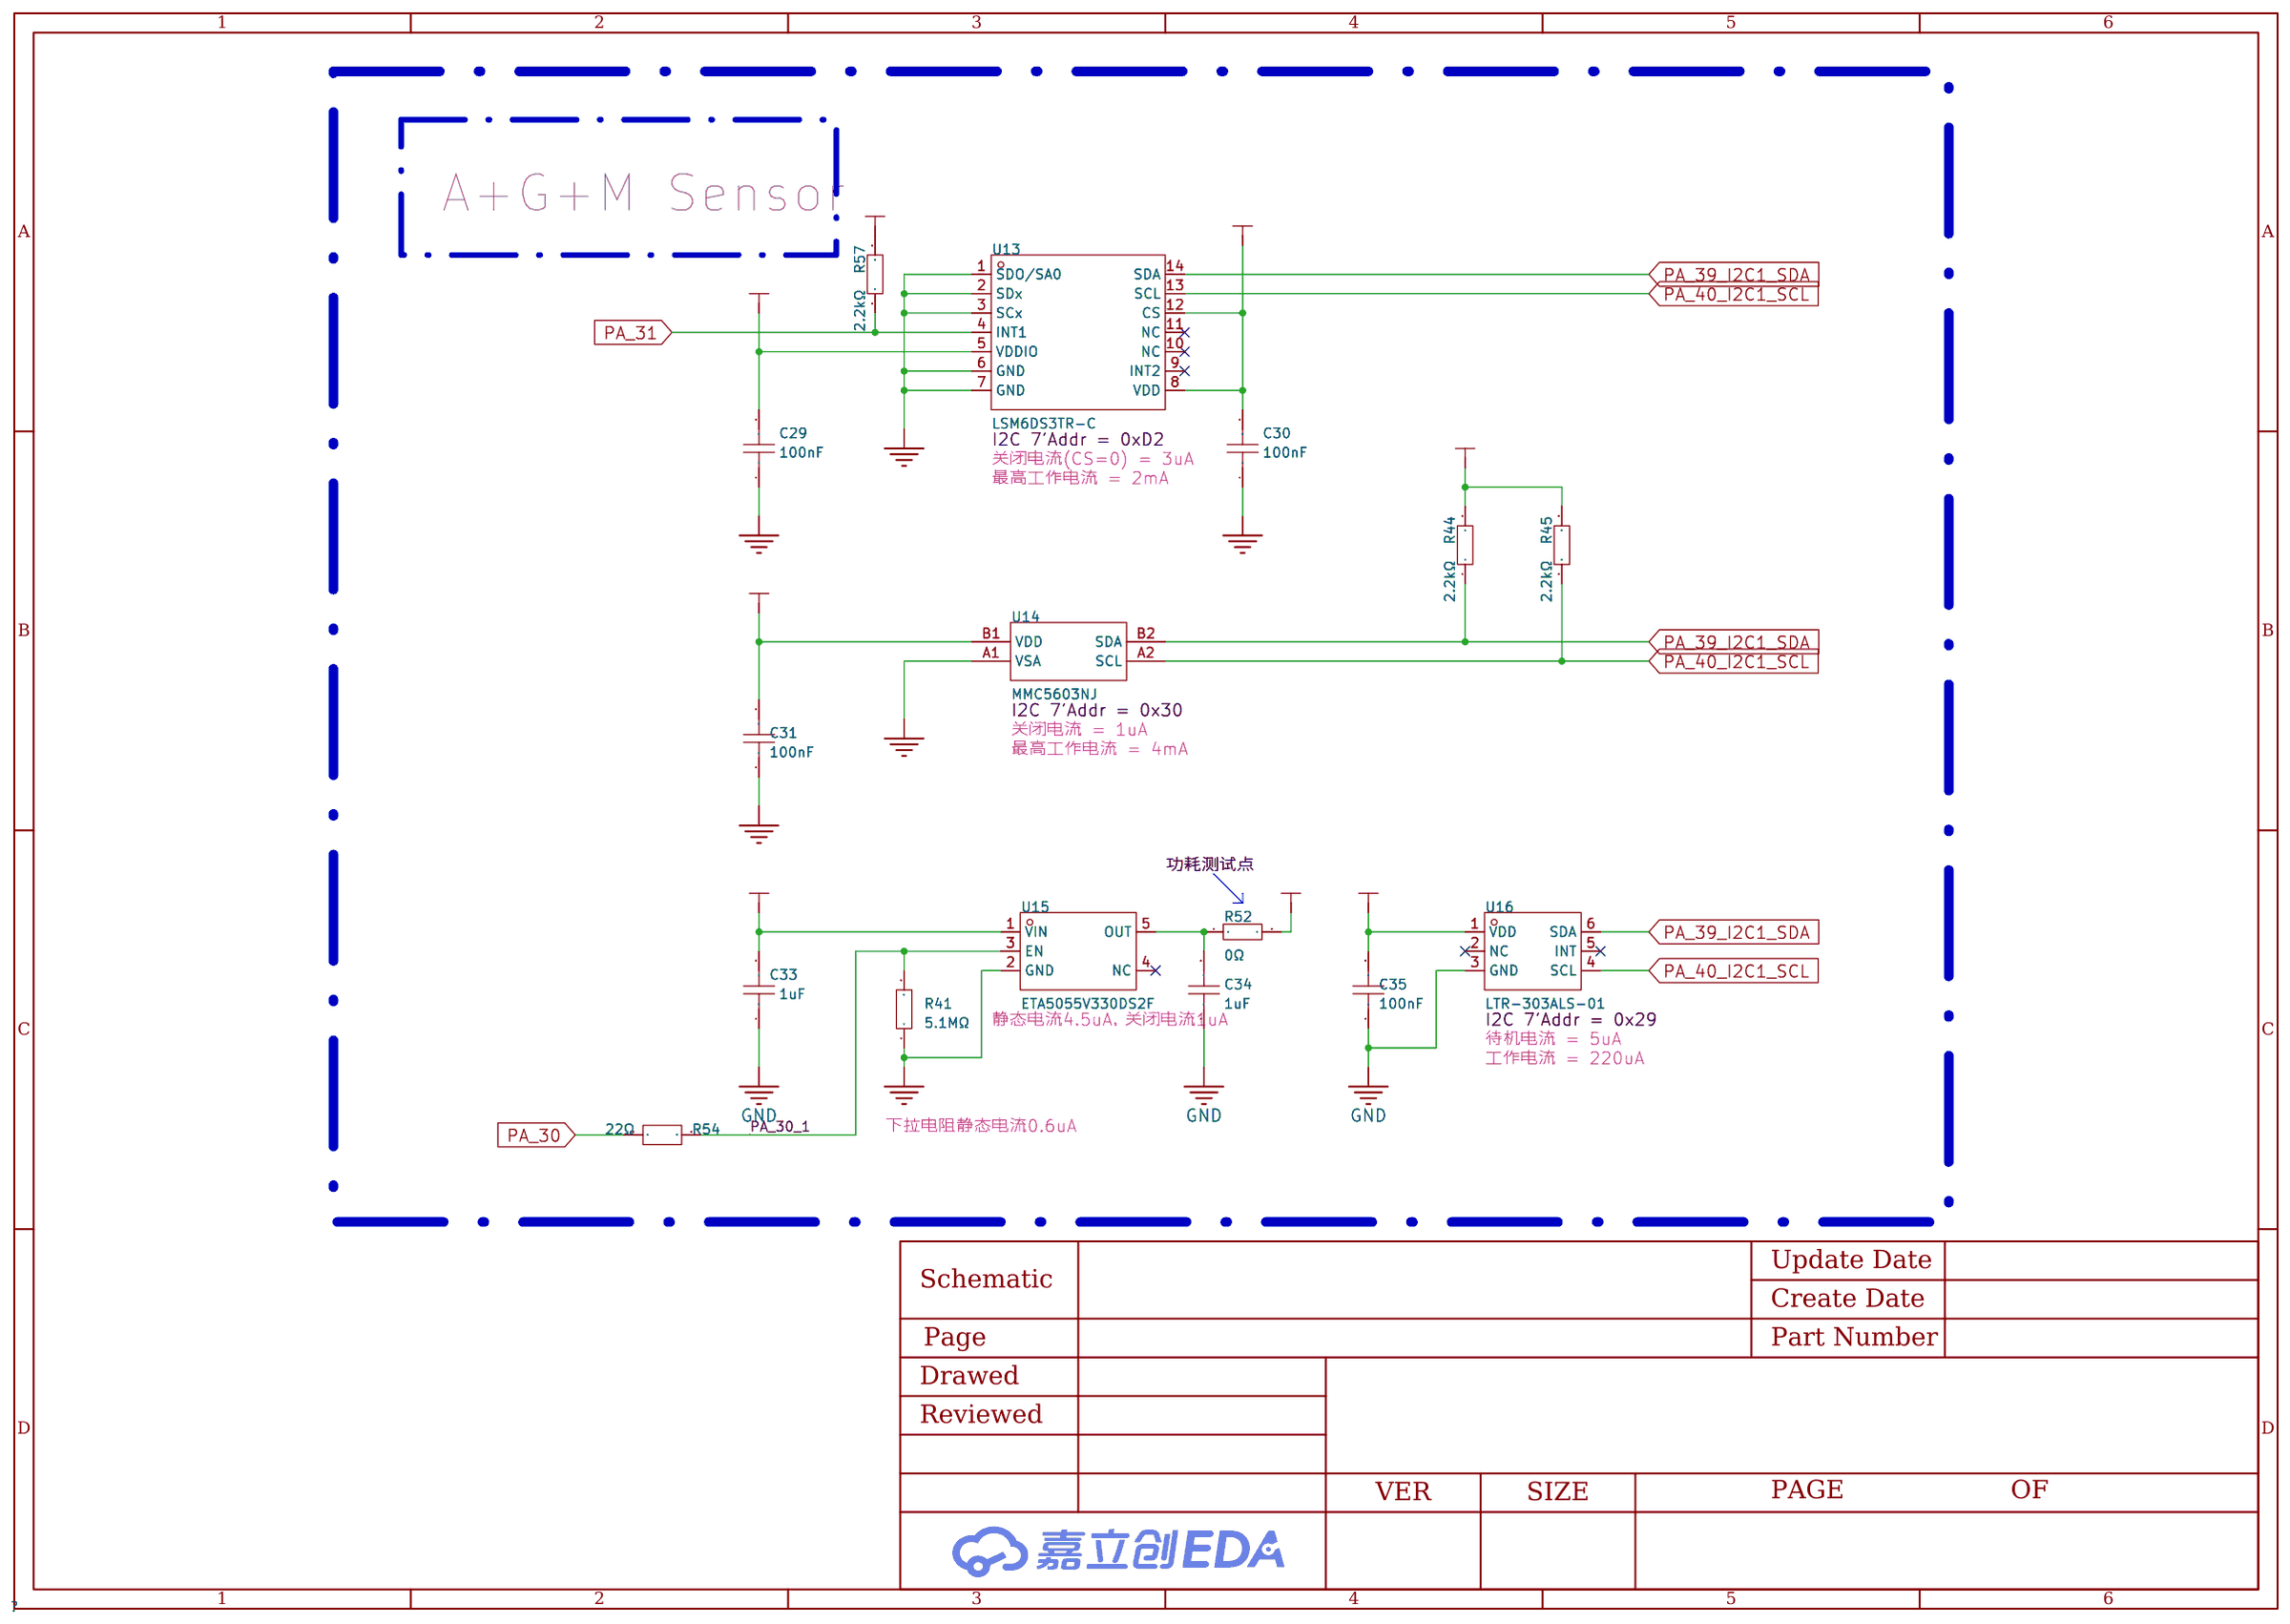
[diagram p8: Sensor]
9 立创·黄山派简介

## Parts
sheet AUDIO
C18  22uF  [C0603]
C19  100nF  [0402]
C20  100nF  [0402]
C21  100nF  [0402]
C22  330pF  [0402]  (no BOM)
C23  330pF  [0402]  (no BOM)
C24  1uF  [0402]
C25  330pF  [0402]  (no BOM)
C26  4.7uF  [0402]
C27  10nF  [0402]
CN2  A1257WR-S-2P  [CONN-SMD_A1257WR-S-2P]
D1  ESD5451N  [DFN1006-2L-BI]
D2  ESD5451N  [DFN1006-2L-BI]
L1  PZ1005U121-1R0TF  [L0402]
L2  PZ1005U121-1R0TF  [L0402]
L3  CBG160808U000T  [L0603]
L4  CBG160808U000T  [L0603]
R26  0Ω  [R0603]
R27  43.2kΩ  [0402]
R28  43.2kΩ  [0402]
R29  5.1MΩ  [0402]
R30  1kΩ  [0402]
U6  NS4150B  [MSOP-8_L3.0-W3.0-P0.65-LS5.0-BL]
U9  LMA2718T421-OA5  [MIC-SMD_4P-L2.8-W1.9-P1.01-TL]
sheet DEBUG
C11  100nF  [0402]
C12  1uF  [0402]
C36  1uF  [0603]
C37  1uF  [0603]
D3  KLXES15AAA1  [D0402-BI]
D4  KLXES15AAA1  [D0402-BI]
R8  0402WGF5101TCE  [0402]
R11  0402WGF1000TCE  [0402]
R12  0402WGF1000TCE  [0402]
R13  0402WGF5101TCE  [0402]
R14  390kΩ  [0402]
R15  510kΩ  [0402]
TP4  -  [TP_C080]  (no BOM)
TP5  -  [TP_C080]  (no BOM)
TP6  -  [TP_C080]  (no BOM)
U5  CH340N  [SOP-8_L4.9-W3.9-P1.27-LS6.0-BL]
U18  ETA5055V330DS2F  [SOT-23-5_L2.9-W1.6-P0.95-LS2.8-BR]
USB1  KH-TYPE-C-16P  [USB-C-SMD_KH-TYPE-C-16P]
sheet GPIO
C28  4.7uF  [0402]
CN3  XDZ127-2-15-S-1.0-G1  [HDR-SMD_30P-P1.27-V-M-R2-C15-LS5.5_1]
D14  ESD5451N  [DFN1006-2L-BI]
D15  ESD5451N  [DFN1006-2L-BI]
D16  CD4148WTP  [D0603-RD]
LED3  WS2812B-2020  [LED-SMD_4P-L2.0-W2.0-TL_WS2812B-2020]
M1  M2-TH  [M2_TH_4_2.5MM]  (no BOM)
M2  M2-TH  [M2_TH_4_2.5MM]  (no BOM)
M3  M2-TH  [M2_TH_4_2.5MM]  (no BOM)
M4  M2-TH  [M2_TH_4_2.5MM]  (no BOM)
MT1  -  [TP-3x2MM]  (no BOM)
MT2  -  [TP-3x2MM]  (no BOM)
Q1  CJ3134K KF  [SOT-723_L1.2-W0.8-P0.40-LS1.2-BR]
Q2  CJ3134K KF  [SOT-723_L1.2-W0.8-P0.40-LS1.2-BR]
R31  0402WGF5101TCE  [0402]
R32  15kΩ  [0402]
R33  0Ω  [0402]
R34  0402WGF5101TCE  [0402]
R35  15kΩ  [0402]
R36  5.1Ω  [0402]
R37  1kΩ  [0402]
R38  1.5MΩ  [0402]
R51  0Ω  [0402]
SW1  GT-TC191A-H026-L60  [KEY-SMD_GT-TC191A-H026-L60]
SW2  GT-TC191A-H026-L60  [KEY-SMD_GT-TC191A-H026-L60]
TP8  -  [TP_C080]  (no BOM)
TP9  -  [TP_C080]  (no BOM)
U20  -  [JLC-QRCODE-6x6]
sheet LCM_QSPI AND TP
C13  1uF  [0402]
C14  100nF  [0402]
C15  4.7uF  [0402]
D5  ESD5451N  [DFN1006-2L-BI]
D6  ESD5451N  [DFN1006-2L-BI]
D7  ESD5451N  [DFN1006-2L-BI]
D8  ESD5451N  [DFN1006-2L-BI]
FPC1  AFH34-S22FIA-1H  [FPC-SMD_22P-P0.50_JS_AFH34-S22FIA-1H]
R16  22Ω  [0402]
R17  22Ω  [0402]
R18  22Ω  [0402]
R19  22Ω  [0402]
R20  22Ω  [0402]
R46  2.2kΩ  [0402]
R47  2.2kΩ  [0402]
R48  2.2kΩ  [0402]
R49  0Ω  [R0603]
R50  0Ω  [R0603]
sheet MicroSD_Card
C16  1uF  [0402]
C17  100nF  [0402]
CARD1  TF-115Y-ACP9  [SIM-SMD_TF-115Y-BCP9]
D9  ESD5451N  [DFN1006-2L-BI]
D10  KLXES15AAA1  [D0402-BI]
D11  KLXES15AAA1  [D0402-BI]
D12  KLXES15AAA1  [D0402-BI]
D13  KLXES15AAA1  [D0402-BI]
R21  22Ω  [0402]
R22  22Ω  [0402]
R23  22Ω  [0402]
R24  22Ω  [0402]
R25  22Ω  [0402]
sheet POWER
C2  1uF  [0402]
C3  4.7uF  [0402]
C4  1uF  [0402]
C5  1uF  [0402]
C6  10uF  [C0603]
C7  1uF  [0402]
C8  4.7uF  [0402]
C9  1uF  [0402]
C10  1uF  [0402]
CN1  A1257WR-S-2P  [CONN-SMD_A1257WR-S-2P]
D17  PTVSHC3N18VU  [DFN-3_L2.0-W2.0-P1.30-BR]
D18  PESDHC2FD12VU  [DFN1006-2L-RD]
LED1  19-217/GHC-YR1S2/3T  [LED0603-RD]
R2  510kΩ  [0402]
R3  5.1MΩ  [0402]
R4  20kΩ  [0402]
R5  100kΩ  [0402]
R6  4.7kΩ  [0402]
R7  5.1MΩ  [0402]
R42  2.2kΩ  [0402]
R43  2.2kΩ  [0402]
R60  100kΩ  [0402]
TP1  -  [TP_C080]  (no BOM)
TP2  -  [TP_C080]  (no BOM)
TP3  -  [TP_C080]  (no BOM)
TP7  -  [TP_C080]  (no BOM)
U2  LP5240HVF  [WLCSP-4_L0.8-W0.8-R2-C2-P0.40-BL]
U3  AW32001ECSR  [WLCSP-9_L1.7-W1.7-R3-C3-P0.50-TL]
U4  ETA5055V330DS2F  [SOT-23-5_L2.9-W1.6-P0.95-LS2.8-BR]
U17  LP5305AQVF  [DFN-8_L2.0-W2.0-P0.50-BL-EP]
sheet Sensor
C29  100nF  [0402]
C30  100nF  [0402]
C31  100nF  [0402]
C33  1uF  [0603]
C34  1uF  [0603]
C35  100nF  [0402]
R41  5.1MΩ  [0402]
R44  2.2kΩ  [0402]
R45  2.2kΩ  [0402]
R52  0Ω  [0603]
R54  22Ω  [0402]
R57  2.2kΩ  [0402]  (no BOM)
U13  LSM6DS3TR-C  [LGA-14_L3.0-W2.5-P0.50-TL]
U14  MMC5603NJ  [FLIPCHIP-4_L0.8-W0.8-R2-C2-P0.40-TL]
U15  ETA5055V330DS2F  [SOT-23-5_L2.9-W1.6-P0.95-LS2.8-BR]
U16  LTR-303ALS-01  [TDFN-6_L2.0-W2.0-P0.65-BL]
sheet SF32LB52-MOD-1
C1  4.7uF  [0402]
C38  1uF  [0402]
R1  0Ω  [R0603]
R55  22Ω  [0402]
R56  22Ω  [0402]
R58  100kΩ  [0402]
R59  0Ω  [R0603]  (no BOM)
U1  SF32LB52-MOD-1-N16R8  [COMM-SMD_L27.9-W18.0-P1.10_SF32LB52-MOD-1-N16R8]  (sections 1,2)
U19  LP5240HVF  [WLCSP-4_L0.8-W0.8-R2-C2-P0.40-BL]

## Library data of the parts
C18 = CL10A226MQ8NRNC: 容值:22uF;精度:±20%;额定电压:6.3V;材质(温度系数):X5R;; LCSC Part Name: 22uF ±20% 6.3V; Supplier Part: C59461; Manufacturer: SAMSUNG(三星); Supplier Footprint: 0603; JLCPCB Part Class: Basic Part; Datasheet: https://atta.szlcsc.com/upload/public/pdf/source/20160103/1457707740762.pdf; Supplier: LCSC; Tolerance: ±20%; Voltage Rated: 6.3V; Temperature Coefficient: X5R
C11 C14 C17 C19-C21 C29-C31 C35 = CL05B104KB54PNC: 容值:100nF;精度:±10%;额定电压:50V;材质(温度系数):X7R;; LCSC Part Name: 100nF ±10% 50V; Supplier Part: C307331; Manufacturer: SAMSUNG(三星); JLCPCB Part Class: Basic Part; Datasheet: https://atta.szlcsc.com/upload/public/pdf/source/20160218/1457707763339.pdf; Supplier: LCSC; Tolerance: ±10%; Voltage Rated: 50V; Temperature Coefficient: X7R
C22 C23 C25 = 0402B331K500NT: 容值:330pF;精度:±10%;额定电压:50V;材质(温度系数):X7R;; LCSC Part Name: 330pF ±10% 50V; Supplier Part: C1535; Manufacturer: FH(风华); JLCPCB Part Class: 扩展库; Datasheet: https://atta.szlcsc.com/upload/public/pdf/source/20200305/C486355_26A10D38EF8C2A5C37091D0039909270.pdf; Supplier: LCSC; Tolerance: ±10%; Voltage Rated: 50V; Temperature Coefficient: X7R
C2 C4 C5 C7 C9 C10 C12 C13 C16 C24 C38 = CL05A105KA5NQNC: 容值:1uF;精度:±10%;额定电压:25V;材质(温度系数):X5R;; LCSC Part Name: 1uF ±10% 25V; Supplier Part: C52923; Manufacturer: SAMSUNG(三星); JLCPCB Part Class: 基础库; Datasheet: https://atta.szlcsc.com/upload/public/pdf/source/20160103/1457707735223.pdf; Supplier: LCSC; Tolerance: ±10%; Voltage Rated: 25V; Temperature Coefficient: X5R
C1 C3 C8 C15 C26 C28 = CL05A475MP5NRNC: 容值:4.7uF;精度:±20%;额定电压:10V;材质(温度系数):X5R;; LCSC Part Name: 4.7uF ±20% 10V; Supplier Part: C23733; Manufacturer: SAMSUNG(三星); JLCPCB Part Class: 基础库; Datasheet: https://atta.szlcsc.com/upload/public/pdf/source/20160218/1457707763339.pdf; Supplier: LCSC; Tolerance: ±20%; Voltage Rated: 10V; Temperature Coefficient: X5R
C27 = CL05B103KB5NNNC: 容值:10nF;精度:±10%;额定电压:50V;材质(温度系数):X7R;; LCSC Part Name: 10nF ±10% 50V; Supplier Part: C15195; Manufacturer: SAMSUNG(三星); JLCPCB Part Class: Basic Part; Datasheet: https://atta.szlcsc.com/upload/public/pdf/source/20160218/1457707763339.pdf; Supplier: LCSC; Tolerance: ±10%; Voltage Rated: 50V; Temperature Coefficient: X7R
CN1 CN2 = A1257WR-S-2P: 参考系列:GH;间距:1.25mm;插针结构:1x2P;排数:1;每排PIN数:2;行距:-;安装方式:-;触头材质:黄铜;; LCSC Part Name: GH1.25卧式贴片 镀锡 2P 针座连接器; Supplier Part: C225125; Manufacturer: CJT(长江连接器); Supplier Footprint: SMD,P=1.25mm; JLCPCB Part Class: 扩展库; Datasheet: https://atta.szlcsc.com/upload/public/pdf/source/20180509/C225125_BADC516D96738E603F25032F5968DE8B.pdf; Supplier: LCSC; Reference Series: GH; Pitch: 1.25mm; Pins Structure: 1x2P; Number of Rows: 1; Number of PINs Per Row: 2; Contact Material: 黄铜
D1 D2 D5-D9 D14 D15 = ESD5451N: Supplier Part: C2987696; Manufacturer: UMW(友台半导体); Supplier Footprint: DFN1006-2; JLCPCB Part Class: Extended Part; Datasheet: https://atta.szlcsc.com/upload/public/pdf/source/20231109/ADF50DFDA976AEDE26D2560D9AE1EB02.pdf; Supplier: LCSC; Type: ESD
L1 L2 = PZ1005U121-1R0TF: 标称阻抗@测试频率:120Ω@100MHz;误差:±25%;直流电阻(RDC):120mΩ;; LCSC Part Name: 单路 0402磁珠 阻抗120Ω@100MHz; Supplier Part: C96723; Manufacturer: Sunlord(顺络); Supplier Footprint: 0402; JLCPCB Part Class: 扩展库; Datasheet: https://atta.szlcsc.com/upload/public/pdf/source/20231030/F43855F21424F0FE92DFF7D0215109E2.pdf; Supplier: LCSC; Impedance @ Frequency: 120Ω@100MHz; Tolerance: ±25%; DC Resistance: 120mΩ; Current Rating: 1A; Circuits: 1
L3 L4 = CBG160808U000T: 标称阻抗@测试频率:0Ω@100MHz;直流电阻(RDC):100mΩ;; LCSC Part Name: 单路 0603磁珠 阻抗0Ω@100MHz; Supplier Part: C43163; Manufacturer: FH(风华); Supplier Footprint: 0603; Datasheet: https://atta.szlcsc.com/upload/public/pdf/source/20190129/C361667_1614D407CC98D1D3CFBD9E1F7511C14D.pdf; Supplier: LCSC; Impedance @ Frequency: 0Ω@100MHz; DC Resistance: 100mΩ; Current Rating: 800mA; Circuits: 1
R1 R26 R49 R50 R59 = 0603WAF0000T5E: 电阻类型:厚膜电阻;阻值:0Ω;精度:±1%;功率:100mW;最大工作电压:75V;工作温度范围:-55℃~+155℃;; LCSC Part Name: 0Ω ±1% 100mW; Supplier Part: C21189; Manufacturer: UNI-ROYAL(厚声); Supplier Footprint: 0603; JLCPCB Part Class: Basic Part; Datasheet: https://atta.szlcsc.com/upload/public/pdf/source/20200306/C422600_1E6D84923E4A46A82E41ADD87F860B5C.pdf; Supplier: LCSC; Type: 厚膜电阻; Tolerance: ±1%; Power(Watts): 100mW; Overload Voltage (Max): 75V; Operating Temperature Range: -55℃~+155℃
R27 R28 = RC0402FR-0743K2L: 电阻类型:厚膜电阻;阻值:43.2kΩ;精度:±1%;功率:62.5mW;最大工作电压:50V;温度系数:±100ppm/℃;; LCSC Part Name: 厚膜电阻 43.2kΩ ±1% 62.5mW; Supplier Part: C137980; Manufacturer: YAGEO(国巨); JLCPCB Part Class: 扩展库; Datasheet: https://atta.szlcsc.com/upload/public/pdf/source/20181009/C309620_DA5935B6E1D48212CB7A533FE518B3C2.pdf; Supplier: LCSC; Type: 厚膜电阻; Tolerance: ±1%; Power(Watts): 62.5mW; Overload Voltage (Max): 50V; Temperature Coefficient: ±100ppm/℃; Operating Temperature Range: -55℃~+155℃
R29 = 0402WGJ0515TCE: 电阻类型:厚膜电阻;阻值:5.1MΩ;精度:±5%;功率:62.5mW;最大工作电压:50V;温度系数:±100ppm/℃;; LCSC Part Name: 5.1MΩ ±5% 62.5mW 厚膜电阻; Supplier Part: C26092; Manufacturer: UNI-ROYAL(厚声); JLCPCB Part Class: Extended Part; Datasheet: https://atta.szlcsc.com/upload/public/pdf/source/20200306/C422600_1E6D84923E4A46A82E41ADD87F860B5C.pdf; Supplier: LCSC; Type: 厚膜电阻; Tolerance: ±5%; Power(Watts): 62.5mW; Overload Voltage (Max): 50V; Temperature Coefficient: ±100ppm/℃; Operating Temperature Range: -55℃~+155℃
R30 R37 = 0402WGF1001TCE: 电阻类型:厚膜电阻;阻值:1kΩ;精度:±1%;功率:62.5mW;温度系数:±100ppm/℃;最大工作电压:50V;工作温度范围:-55℃~+155℃;; LCSC Part Name: 1kΩ ±1% 62.5mW; Supplier Part: C11702; Manufacturer: UNI-ROYAL(厚声); JLCPCB Part Class: Basic Part; Datasheet: https://atta.szlcsc.com/upload/public/pdf/source/20200306/C422600_1E6D84923E4A46A82E41ADD87F860B5C.pdf; Supplier: LCSC; Type: 厚膜电阻; Tolerance: ±1%; Power(Watts): 62.5mW; Temperature Coefficient: ±100ppm/℃; Overload Voltage (Max): 50V; Operating Temperature Range: -55℃~+155℃
U6 = NS4150B_C189961: 功放类型:D类功放;输出功率:3Wx1@4Ω;; Supplier Part: C189961; Manufacturer: Nsiway(纳芯威); Supplier Footprint: MSOP-8; JLCPCB Part Class: 扩展库; Datasheet: https://atta.szlcsc.com/upload/public/pdf/source/20220916/DAE631F3909B9CBB38BDE76E3E6D5896.pdf; Supplier: LCSC; Type of Power Amplifier: D类功放; Output Power: 3Wx1@4Ω; Supply Voltage: 3V~5.25V
U9 = LMA2718T421-OA5: 指向性:全指向;信噪比:55dB;灵敏度:-42dB;阻抗:300Ω;; LCSC Part Name: MEMSmic硅麦2718 上进音 s-42db±1; Supplier Part: C5373232; Manufacturer: LinkMems(聆麦声学); Supplier Footprint: SMD-4P,2.8x1.9mm; JLCPCB Part Class: 扩展库; Datasheet: https://atta.szlcsc.com/upload/public/pdf/source/20240604/7EB4DC8EC93CD928AABB30A94F119624.pdf; Supplier: LCSC; Direction: 全指向; Voltage - Supply: 1.6V~3.6V; Current Consumption: 120uA; S/N Ratio: 55dB; Sensitivity: -42dB; Impedance: 300Ω
C33 C34 C36 C37 = CL10A105KB8NNNC: 容值:1uF;精度:±10%;额定电压:50V;材质(温度系数):X5R;; LCSC Part Name: 1uF ±10% 50V; Supplier Part: C15849; Manufacturer: SAMSUNG(三星); JLCPCB Part Class: Basic Part; Datasheet: https://atta.szlcsc.com/upload/public/pdf/source/20160218/1457707763339.pdf; Supplier: LCSC; Tolerance: ±10%; Voltage Rated: 50V; Temperature Coefficient: X5R
D3 D4 D10-D13 = KLXES15AAA1: 极性:双向;反向截止电压(Vrwm):5V;最大钳位电压:40V;; LCSC Part Name: 双向ESD; Supplier Part: C2892490; Manufacturer: KUU; Supplier Footprint: 0402; JLCPCB Part Class: Extended Part; Datasheet: https://atta.szlcsc.com/upload/public/pdf/source/20210908/40FD94D5521B4EF0ED53BC030E77ED53.pdf; Supplier: LCSC; Polarity: 双向; Reverse Stand-Off Voltage (Vrwm): 5V; Clamping Voltage@Ipp: 40V; polarity: 双向; Maximum Clamping Voltage: 40V; Reverse Leakage Current (Ir): 10nA; Number of Lines: 单路; Operating Temperature: -55℃~+125℃@(Tj); Type: ESD
R8 R13 = 0402WGF5101TCE: LCSC Part Name: 5.1KΩ(5101) ±1%; Supplier Part: C25905; Manufacturer: UNI-ROYAL(厚声); JLCPCB Part Class: Basic Part; Datasheet: https://atta.szlcsc.com/upload/public/pdf/source/20170920/C25905_1505895107382980911.pdf; Supplier: LCSC
R11 R12 = 0402WGF1000TCE: Supplier: LCSC; Supplier Part: C25076; JLCPCB Part Class: Basic Part; LCSC Part Name: 100Ω(1000) ±1% 编带; Datasheet: https://atta.szlcsc.com/upload/public/pdf/source/20170920/C25076_1505901197574982707.pdf; Manufacturer: UNI-ROYAL(厚声)
R14 = 0402WGJ0394TCE: 电阻类型:厚膜电阻;阻值:390kΩ;精度:±5%;功率:62.5mW;最大工作电压:50V;温度系数:±100ppm/℃;; LCSC Part Name: 390kΩ ±5% 62.5mW 厚膜电阻; Supplier Part: C25557; Manufacturer: UNI-ROYAL(厚声); JLCPCB Part Class: 扩展库; Datasheet: https://atta.szlcsc.com/upload/public/pdf/source/20200306/C422600_1E6D84923E4A46A82E41ADD87F860B5C.pdf; Supplier: LCSC; Type: 厚膜电阻; Tolerance: ±5%; Power(Watts): 62.5mW; Overload Voltage (Max): 50V; Temperature Coefficient: ±100ppm/℃; Operating Temperature Range: -55℃~+155℃
R2 R15 = 0402WGJ0514TCE: 电阻类型:厚膜电阻;阻值:510kΩ;精度:±5%;功率:62.5mW;最大工作电压:50V;温度系数:±100ppm/℃;; LCSC Part Name: 510kΩ ±5% 62.5mW 厚膜电阻; Supplier Part: C25564; Manufacturer: UNI-ROYAL(厚声); JLCPCB Part Class: 扩展库; Datasheet: https://atta.szlcsc.com/upload/public/pdf/source/20200306/C422600_1E6D84923E4A46A82E41ADD87F860B5C.pdf; Supplier: LCSC; Type: 厚膜电阻; Tolerance: ±5%; Power(Watts): 62.5mW; Overload Voltage (Max): 50V; Temperature Coefficient: ±100ppm/℃; Operating Temperature Range: -55℃~+155℃
TP1-TP9 = TP-C080
U5 = CH340N: 应用功能:USB转串口;接口协议:USB 2.0;通道数:1;数据速率:2Mbps;; LCSC Part Name: USB转串口芯片CH340; Supplier Part: C2977777; Manufacturer: WCH(南京沁恒); Supplier Footprint: SOP-8; JLCPCB Part Class: 扩展库; Datasheet: https://atta.szlcsc.com/upload/public/pdf/source/20240313/115CDE92081B1D6CB446704AD5D0F5F2.pdf; Supplier: LCSC; Applications Function: USB转串口; Protocol: USB 2.0; Number of Channels: 1; Supply Voltage: 3.3V；5V; Data Rate: 2Mbps; Operating Temperature: -20℃~+70℃
U4 U15 U18 = ETA5055V330DS2F: Supplier Part: C22362747; Manufacturer: ETA(钰泰); Supplier Footprint: SOT-23-5; JLCPCB Part Class: 扩展库; Datasheet: https://atta.szlcsc.com/upload/public/pdf/source/20240315/DF3CDFBA86AB03D755AD0835E472D9FB.pdf; Supplier: LCSC
USB1 = KH-TYPE-C-16P: 连接器类型:Type-C;标准:-;公母:母座;触点数量:16;端口数量:1;安装方式:卧贴;额定电流 - 电源:3A;工作温度范围:-40℃~+85℃;; LCSC Part Name: Type-C 母座 卧贴; Supplier Part: C709357; Manufacturer: kinghelm(金航标); Supplier Footprint: SMD; JLCPCB Part Class: Extended Part; Datasheet: https://atta.szlcsc.com/upload/public/pdf/source/20200911/C709357_AA8DCEB38BB20E3035A7ED7AE7667837.pdf; Supplier: LCSC; Connector Type: Type-C; Gender: 母座; Number of Contacts: 16; Number of Ports: 1; Mounting Style: 卧贴; Current Rating - Power (Max): 3A; Operating Temperature Range: -40℃~+85℃
CN3 = XDZ127-2-15-S-1.0-G1: 插针结构:2x15P;间距:1.27mm;圆针/方针:方针;安装类型:立贴;排数:双排;总PIN位数:30P;额定电流:1A;配合针长度:4mm;塑高:1mm;工作温度范围:-40℃~+105℃;颜色:黑色;; Manufacturer: XUNDA(讯答); Supplier: LCSC; Supplier Part: C19268856; LCSC Part Name: 2x15P 间距:1.27mm 立贴 方针; Supplier Footprint: SMD,P=1.27mm; Datasheet: https://atta.szlcsc.com/upload/public/pdf/source/20231121/132ADD8FE50D9D5F7A5EBF788BB0A2C5.pdf; Pin Structure: 2x15P; Pitch: 1.27mm; Circluar Pins/Square Pins: 方针; Mounting Type: 立贴; Number of Rows: 双排; Number of Pins: 30P; Current Rating (Max): 1A; Length of Mating Pin: 4mm; Insulation Height: 1mm; Operating Temperature Range: -40℃~+105℃; Color: 黑色
D16 = CD4148WTP_C30584800: 二极管配置:独立式;正向压降(Vf):1.25V@100mA;直流反向耐压(Vr):75V;整流电流:100mA;反向恢复时间(trr):4ns;; LCSC Part Name: 电压:75V 电流:100mA; Supplier Part: C30584800; Manufacturer: YONGYUTAI(永裕泰); Supplier Footprint: 0603; JLCPCB Part Class: 扩展库; Datasheet: https://atta.szlcsc.com/upload/public/pdf/source/20240725/F6690E735E647F403BA9BCE40A08BD71.pdf; Supplier: LCSC; Diode Configuration: 独立式; Forward Voltage (Vf@If): 1.25V@100mA; Reverse Voltage (Vr): 75V; Rectified Current: 100mA; Reverse Leakage Current: 5uA@75V; Reverse Recovery Time (trr): 4ns; Operating Temperature: 150℃@(Tj)
LED3 = WS2812B-2020: 12mA，小尺寸，高亮，用于小间距，小尺寸产品（注意防潮，请查阅规格书中对应具体内容）; LCSC Part Name: RGB三色; Supplier Part: C965555; Manufacturer: worldsemi; Supplier Footprint: SMD,2x2mm; JLCPCB Part Class: 扩展库; Datasheet: https://atta.szlcsc.com/upload/public/pdf/source/20241202/DEE3FC25B8AD87F3BB1718ACD77EDECD.pdf; Supplier: LCSC; Wavelength: 515.6nm；622.5nm；470.4nm
M1-M4 = M2-TH: Check: false
MT1 MT2 = TP_2x3MM: Check: false
Q1 Q2 = CJ3134K KF: 类型:1个N沟道;漏源电压(Vdss):20V;连续漏极电流(Id):750mA;导通电阻(RDS(on)@Vgs,Id):380mΩ@4.5V,650mA;功率(Pd):150mW;阈值电压(Vgs(th)@Id):1.1V@250uA;; LCSC Part Name: 1个N沟道 耐压:20V 电流:750mA; Supplier Part: C62503; Manufacturer: CJ(江苏长电/长晶); Supplier Footprint: SOT-723; JLCPCB Part Class: 扩展库; Datasheet: https://atta.szlcsc.com/upload/public/pdf/source/20160416/1460799387864.pdf; Supplier: LCSC; Type: 1个N沟道; Drain Source Voltage (Vdss): 20V; Continuous Drain Current (Id): 750mA; Drain Source On Resistance (RDS(on)@Vgs,Id): 380mΩ@4.5V,650mA; Power Dissipation (Pd): 150mW; Gate Threshold Voltage (Vgs(th)@Id): 1.1V@250uA
R31 R34 = 0402WGF5101TCE: LCSC Part Name: 5.1KΩ(5101) ±1% 编带; Supplier Part: C25905; Manufacturer: UNI-ROYAL(厚声); JLCPCB Part Class: Basic Part; Datasheet: https://atta.szlcsc.com/upload/public/pdf/source/20170920/C25905_1505895107382980911.pdf; Supplier: LCSC
R32 R35 = 0402WGF1502TCE: 功率:1/16W;精度:±1%;温度系数:±100ppm/℃;阻值:15kΩ;最大工作电压:50V;工作温度范围:-55℃~+155℃;; LCSC Part Name: 15KΩ ±1%; Supplier Part: C25756; Manufacturer: UNI-ROYAL(厚声); JLCPCB Part Class: Basic Part; Datasheet: https://atta.szlcsc.com/upload/public/pdf/source/20170920/C25756_1505901528443983332.pdf; Supplier: LCSC; Power(Watts): 1/16W; Tolerance: ±1%; Temperature Coefficient: ±100ppm/℃; Overload Voltage (Max): 50V; Operating Temperature Range: -55℃~+155℃
R33 R51 = 0402WGF0000TCE: 电阻类型:厚膜电阻;阻值:0Ω;精度:±1%;功率:62.5mW;; LCSC Part Name: 0Ω ±1% 62.5mW; Supplier Part: C17168; Manufacturer: UNI-ROYAL(厚声); JLCPCB Part Class: 基础库; Datasheet: https://atta.szlcsc.com/upload/public/pdf/source/20200306/C422600_1E6D84923E4A46A82E41ADD87F860B5C.pdf; Supplier: LCSC; Type: 厚膜电阻; Tolerance: ±1%; Power(Watts): 62.5mW; Temperature Coefficient: ±800ppm/℃; Overload Voltage (Max): 50V; Operating Temperature Range: -55℃~+155℃
R36 = 0402WGF510KTCE: 电阻类型:厚膜电阻;阻值:5.1Ω;精度:±1%;功率:62.5mW;最大工作电压:50V;温度系数:±400ppm/℃;; LCSC Part Name: 5.1Ω ±1% 62.5mW 厚膜电阻; Supplier Part: C25128; Manufacturer: UNI-ROYAL(厚声); JLCPCB Part Class: 扩展库; Datasheet: https://atta.szlcsc.com/upload/public/pdf/source/20200306/C422600_1E6D84923E4A46A82E41ADD87F860B5C.pdf; Supplier: LCSC; Type: 厚膜电阻; Tolerance: ±1%; Power(Watts): 62.5mW; Overload Voltage (Max): 50V; Temperature Coefficient: ±400ppm/℃; Operating Temperature Range: -55℃~+155℃
R38 = 0402WGF1504TCE: 电阻类型:厚膜电阻;阻值:1.5MΩ;精度:±1%;功率:62.5mW;最大工作电压:50V;温度系数:±100ppm/℃;; LCSC Part Name: 1.5MΩ ±1% 62.5mW 厚膜电阻; Supplier Part: C22276; Manufacturer: UNI-ROYAL(厚声); JLCPCB Part Class: 扩展库; Datasheet: https://atta.szlcsc.com/upload/public/pdf/source/20200306/C422600_1E6D84923E4A46A82E41ADD87F860B5C.pdf; Supplier: LCSC; Type: 厚膜电阻; Tolerance: ±1%; Power(Watts): 62.5mW; Overload Voltage (Max): 50V; Temperature Coefficient: ±100ppm/℃; Operating Temperature Range: -55℃~+155℃
SW1 SW2 = GT-TC191A-H026-L60: 电路结构:单刀单掷;按钮形状:圆形按钮;作用力:1.8N;安装方式:卧贴;开关长度:2.2mm;开关宽度:4.5mm;开关高度:2.6mm;带支架:不带;触点电流:50mA;额定电压(DC):12V;绝缘电阻:100MΩ;带灯:无;机械寿命:10万次;; LCSC Part Name: 2.2*4.5*2.6mm 卧贴 轻触开关; Supplier Part: C2890363; Manufacturer: G-Switch(品赞); Supplier Footprint: SMD; JLCPCB Part Class: 扩展库; Datasheet: https://atta.szlcsc.com/upload/public/pdf/source/20210903/827026A73FC85D31E29B802EE66DB347.pdf; Supplier: LCSC; Circuit: 单刀单掷; Actuator Style: 圆形按钮; Operating Force: 1.8N; Mounting Style: 卧贴; Switch Length: 2.2mm; Switch Width: 4.5mm; Switch Height: 2.6mm; Strike Gundam: 不带; Contact Current: 50mA; Voltage Rating (DC): 12V; Insulation Resistance: 100MΩ; Actuator/Cap Color: 黑色; With Lamp: 无; Pin Style: SMD接片; Mechanical Life: 10万次; Operating Temperature: -30℃~+85℃
U20 = 嘉立创二维码6x6
FPC1 = AFH34-S22FIA-1H: 锁定特性:翻盖式;触点类型:双侧触点/上下接;触点数量:22P;间距:0.5mm;安装类型:卧贴;; Supplier Part: C5139829; Manufacturer: JS(钜硕电子); Supplier Footprint: SMD,P=0.5mm; JLCPCB Part Class: 扩展库; Datasheet: https://atta.szlcsc.com/upload/public/pdf/source/20220815/7D7DE7AF64D38F9F159F8B104D5F304C.pdf; Supplier: LCSC; Locking Feature: 翻盖式; Contact Type: 双侧触点/上下接; Number of Contacts: 22P; Pitch: 0.5mm; Mounting Type: 卧贴; Height Above Board: 1mm; Contact Plating: 金
R16-R24 R54-R56 = 0402WGF220JTCE: 电阻类型:厚膜电阻;阻值:22Ω;精度:±1%;功率:62.5mW;温度系数:±100ppm/℃;; LCSC Part Name: 厚膜电阻 22Ω ±1% 62.5mW; Supplier Part: C25092; Manufacturer: UNI-ROYAL(厚声); JLCPCB Part Class: Basic Part; Datasheet: https://atta.szlcsc.com/upload/public/pdf/source/20200306/C422600_1E6D84923E4A46A82E41ADD87F860B5C.pdf; Supplier: LCSC; Type: 厚膜电阻; Tolerance: ±1%; Power(Watts): 62.5mW; Temperature Coefficient: ±100ppm/℃; Overload Voltage (Max): 50V; Operating Temperature Range: -55℃~+155℃
R42-R48 R57 = 0402WGF2201TCE: 电阻类型:厚膜电阻;阻值:2.2kΩ;精度:±1%;功率:62.5mW;; LCSC Part Name: 2.2kΩ ±1% 62.5mW; Supplier Part: C25879; Manufacturer: UNI-ROYAL(厚声); JLCPCB Part Class: 基础库; Datasheet: https://atta.szlcsc.com/upload/public/pdf/source/20200306/C422600_1E6D84923E4A46A82E41ADD87F860B5C.pdf; Supplier: LCSC; Type: 厚膜电阻; Tolerance: ±1%; Power(Watts): 62.5mW; Temperature Coefficient: ±100ppm/℃; Overload Voltage (Max): 50V; Operating Temperature Range: -55℃~+155℃
CARD1 = TF-115Y-ACP9: 卡连接方式:自弹式;卡类型:MicroSD卡(TF卡);连接器类型:卡座;本体最大高度:-;工作温度范围:-25℃~+90℃;; LCSC Part Name: 自弹式 MicroSD卡(TF卡) 卡座; Supplier Part: C5454948; Manufacturer: XUNPU(讯普); Supplier Footprint: SMD; JLCPCB Part Class: Extended Part; Datasheet: https://atta.szlcsc.com/upload/public/pdf/source/20230427/4E99E1C1AE495F1492B014240EB95212.pdf; Supplier: LCSC; Card Connection Mode: 自弹式; Card Type: MicroSD卡(TF卡); Connector Type: 卡座; Additional Card Detection Pins: 有; Supplementary Features: 带定位柱; Operating Temperature Range: -25℃~+90℃
R25 = 0402WGF220JTCE: 电阻类型:厚膜电阻;阻值:22Ω;精度:±1%;功率:62.5mW;最大工作电压:50V;温度系数:±100ppm/℃;; LCSC Part Name: 22Ω ±1% 62.5mW 厚膜电阻; Supplier Part: C25092; Manufacturer: UNI-ROYAL(厚声); JLCPCB Part Class: Basic Part; Datasheet: https://atta.szlcsc.com/upload/public/pdf/source/20200306/C422600_1E6D84923E4A46A82E41ADD87F860B5C.pdf; Supplier: LCSC; Type: 厚膜电阻; Tolerance: ±1%; Power(Watts): 62.5mW; Temperature Coefficient: ±100ppm/℃; Overload Voltage (Max): 50V; Operating Temperature Range: -55℃~+155℃
C6 = CL10A106KP8NNNC: 容值:10uF;精度:±10%;额定电压:10V;材质(温度系数):X5R;; LCSC Part Name: 10uF ±10% 10V; Supplier Part: C19702; Manufacturer: SAMSUNG(三星); Supplier Footprint: 0603; JLCPCB Part Class: Basic Part; Datasheet: https://atta.szlcsc.com/upload/public/pdf/source/20160103/1457707703378.pdf; Supplier: LCSC; Tolerance: ±10%; Voltage Rated: 10V; Temperature Coefficient: X5R
D17 = PTVSHC3N18VU: 反向截止电压(Vrwm):18V;最大钳位电压:33V;峰值脉冲电流(Ipp):138A@8/20us;击穿电压:19V;; LCSC Part Name: 单向TVS 18V截止 138A峰值脉冲; Supplier Part: C312227; Manufacturer: Prisemi(芯导); Supplier Footprint: DFN-3(2x2); JLCPCB Part Class: 扩展库; Datasheet: https://atta.szlcsc.com/upload/public/pdf/source/20181106/C312227_851A19EDED3E0B74340DBA7CA4475E94.pdf; Supplier: LCSC; Reverse Stand-Off Voltage (Vrwm): 18V; Maximum Clamping Voltage: 33V; Peak Pulse Current (Ipp): 138A@8/20us; Breakdown Voltage: 19V; Type: TVS
D18 = PESDHC2FD12VU: Supplier Part: C496537; Manufacturer: Prisemi(芯导); Supplier Footprint: DFN1006-2L; JLCPCB Part Class: 扩展库; Datasheet: https://atta.szlcsc.com/upload/public/pdf/source/20200316/C496537_D4D5EFB16D45800B48AEB35AB1FE765F.pdf; Supplier: LCSC
LED1 = 19-217/GHC-YR1S2/3T: 发光颜色:翠绿;二极管配置:-;主波长:520nm~535nm;色温:-;功率:110mW;安装方式:-;; Supplier Part: C72043; Manufacturer: EVERLIGHT(亿光); Supplier Footprint: 0603; JLCPCB Part Class: Basic Part; Datasheet: https://atta.szlcsc.com/upload/public/pdf/source/20160507/1462613613780.pdf; Supplier: LCSC; Emitted Color: 翠绿; Lens Color: 无色透明; Dominant Wavelength: 520nm~535nm; Peak Wavelength: 518nm; Forward Current: 20mA; Power Dissipation: 110mW; Viewing Angle: 120°; Operating Temperature: -40℃~+85℃
R3 R7 R41 = 0402WGJ0515TCE: 电阻类型:厚膜电阻;阻值:5.1MΩ;精度:±5%;功率:62.5mW;最大工作电压:50V;温度系数:±100ppm/℃;; LCSC Part Name: 5.1MΩ ±5% 62.5mW 厚膜电阻; Supplier Part: C26092; Manufacturer: UNI-ROYAL(厚声); JLCPCB Part Class: 扩展库; Datasheet: https://atta.szlcsc.com/upload/public/pdf/source/20200306/C422600_1E6D84923E4A46A82E41ADD87F860B5C.pdf; Supplier: LCSC; Type: 厚膜电阻; Tolerance: ±5%; Power(Watts): 62.5mW; Overload Voltage (Max): 50V; Temperature Coefficient: ±100ppm/℃; Operating Temperature Range: -55℃~+155℃
R4 = 0402WGF2002TCE: 电阻类型:厚膜电阻;阻值:20kΩ;精度:±1%;功率:62.5mW;温度系数:±100ppm/℃;最大工作电压:50V;工作温度范围:-55℃~+155℃;; LCSC Part Name: 20kΩ ±1% 62.5mW; Supplier Part: C25765; Manufacturer: UNI-ROYAL(厚声); JLCPCB Part Class: Basic Part; Datasheet: https://atta.szlcsc.com/upload/public/pdf/source/20200306/C422600_1E6D84923E4A46A82E41ADD87F860B5C.pdf; Supplier: LCSC; Type: 厚膜电阻; Tolerance: ±1%; Power(Watts): 62.5mW; Temperature Coefficient: ±100ppm/℃; Overload Voltage (Max): 50V; Operating Temperature Range: -55℃~+155℃
R5 R58 R60 = 0402WGF1003TCE: 电阻类型:厚膜电阻;阻值:100kΩ;精度:±1%;功率:62.5mW;温度系数:±100ppm/℃;最大工作电压:50V;工作温度范围:-55℃~+155℃;; LCSC Part Name: 100kΩ ±1% 62.5mW; Supplier Part: C25741; Manufacturer: UNI-ROYAL(厚声); JLCPCB Part Class: Basic Part; Datasheet: https://atta.szlcsc.com/upload/public/pdf/source/20200306/C422600_1E6D84923E4A46A82E41ADD87F860B5C.pdf; Supplier: LCSC; Type: 厚膜电阻; Tolerance: ±1%; Power(Watts): 62.5mW; Temperature Coefficient: ±100ppm/℃; Overload Voltage (Max): 50V; Operating Temperature Range: -55℃~+155℃
R6 = 0402WGF4701TCE: 电阻类型:厚膜电阻;阻值:4.7kΩ;精度:±1%;功率:62.5mW;; LCSC Part Name: 4.7kΩ ±1% 62.5mW; Supplier Part: C25900; Manufacturer: UNI-ROYAL(厚声); JLCPCB Part Class: Basic Part; Datasheet: https://atta.szlcsc.com/upload/public/pdf/source/20200306/C422600_1E6D84923E4A46A82E41ADD87F860B5C.pdf; Supplier: LCSC; Power(Watts): 62.5mW; Tolerance: ±1%; Temperature Coefficient: ±100ppm/℃; Overload Voltage (Max): 50V; Operating Temperature Range: -55℃~+155℃; Type: 厚膜电阻
U2 U19 = LP5240HVF: 内阻50mΩ@5V;低静态电流小于240nA；; Supplier Part: C2890373; Manufacturer: LOWPOWER(微源半导体); Supplier Footprint: WLCSP-4; JLCPCB Part Class: 扩展库; Datasheet: https://atta.szlcsc.com/upload/public/pdf/source/20210827/E0ADD1617C58E0EF687E01EAA410AE8B.pdf; Supplier: LCSC
U3 = AW32001ECSR: LCSC Part Name: 带电源通路的单电池锂离子充电器; Supplier Part: C5125890; Manufacturer: AWINIC(艾为); Supplier Footprint: WLCSP-9-B(1.68x1.68); JLCPCB Part Class: Extended Part; Datasheet: https://atta.szlcsc.com/upload/public/pdf/source/20221108/4AE5CFE03757D8E94FB0DD886291B2CA.pdf; Supplier: LCSC
U17 = LP5305AQVF: Supplier Part: C517045; Manufacturer: LOWPOWER(微源半导体); Supplier Footprint: DFN-8-EP(2x2); JLCPCB Part Class: Extended Part; Datasheet: https://atta.szlcsc.com/upload/public/pdf/source/20200421/C517045_A43B38B3E9CE139032ECF74CBC43A3C4.pdf; Supplier: LCSC
R52 = 0603WAF0000T5E: 电阻类型:厚膜电阻;阻值:0Ω;精度:±1%;功率:100mW;最大工作电压:75V;工作温度范围:-55℃~+155℃;; LCSC Part Name: 0Ω ±1% 100mW; Supplier Part: C21189; Manufacturer: UNI-ROYAL(厚声); JLCPCB Part Class: Basic Part; Datasheet: https://atta.szlcsc.com/upload/public/pdf/source/20200306/C422600_1E6D84923E4A46A82E41ADD87F860B5C.pdf; Supplier: LCSC; Type: 厚膜电阻; Tolerance: ±1%; Power(Watts): 100mW; Overload Voltage (Max): 75V; Operating Temperature Range: -55℃~+155℃
U13 = LSM6DS3TR-C: 传感器类型:加速度计陀螺仪;; LCSC Part Name: IMU-惯性测量单元; Supplier Part: C967633; Manufacturer: ST(意法半导体); Supplier Footprint: LGA-14(2.5x3); JLCPCB Part Class: 扩展库; Datasheet: https://atta.szlcsc.com/upload/public/pdf/source/20210226/C967633_4D8B3A108D63359423D57B97CE5134B1.pdf; Supplier: LCSC; Sensor Type: 加速度计陀螺仪; Operating Temperature: -40℃~+85℃
U14 = MMC5603NJ: LCSC Part Name: 三轴磁传感器; Supplier Part: C404328; Manufacturer: MEMSIC(美新); Supplier Footprint: WLP-4(0.8x0.8); JLCPCB Part Class: 扩展库; Datasheet: https://atta.szlcsc.com/upload/public/pdf/source/20190725/C404328_5F9A2DCBD2C623D098113EAC9016F220.pdf; Supplier: LCSC
U16 = LTR-303ALS-01: Supplier Part: C364577; Manufacturer: LITEON(光宝); Supplier Footprint: DFN-6(2x2); JLCPCB Part Class: 扩展库; Datasheet: https://atta.szlcsc.com/upload/public/pdf/source/20190228/C364577_22D9C2451404EB1C918B95CD5CAED65B.pdf; Supplier: LCSC
U1 = SF32LB52-MOD-1-N16R8: 核心芯片:SF32LB525UC6芯片;接口类型:I2C；GPIO；SPI；PWM；ADC；LCD；UART；USB；I2S；SDIO;发射功率:19dBm;通讯距离:-;接收灵敏度:-100dBm;; LCSC Part Name: 立创·思澈SF32LB52模组; Supplier Part: C42924267; Manufacturer: 立创开发板; Supplier Footprint: SMD,18x27.9mm; Datasheet: https://atta.szlcsc.com/upload/public/pdf/source/20250214/6C779412E99CE7B4D9B52ABACA6C0C7A.pdf; Supplier: LCSC; Utilized IC / Part: SF32LB525UC6芯片; Interface Type: I2C；GPIO；SPI；PWM；ADC；LCD；UART；USB；I2S；SDIO; Wireless Standard: 蓝牙5.3; Output Power(Max): 19dBm; Voltage - Supply: 3.2V~4.7V; Antenna Type: 板载PCB天线; Receive  Current: 2mA; Send  Current: 2.6mA; Sensitivity: -100dBm; Operating Temperature: -40℃~+85℃

## Nets
GND: C1.1 C2.1 C3.1 C4.1 C5.1 C6.1 C7.1 C8.1 C9.1 C10.1 C11.2 C12.1 C13.2 C14.1 C15.1 C16.1 C17.1 C28.1 C29.1 C30.1 C31.1 C33.1 C34.1 C35.1 C36.1 C37.1 C38.1 CARD1.6(VSS) CARD1.10(G3) CARD1.11(G4) CARD1.12(G1) CARD1.13(G2) CN1.1 CN1.3 CN1.4 CN3.3 CN3.4 CN3.9 CN3.10 D3.1(K) D4.1(K) D5.1 D6.1 D7.1 D8.1 D9.1 D10.1(K) D11.1(K) D12.1(K) D13.1(K) D14.1 D15.1 D17.1(A) D17.2(A) D18.2(A) FPC1.22 FPC1.23 FPC1.24 L3.1 L4.1 LED1.1(C) LED3.2(GND) M1.1 M2.1 M3.1 M4.1 Q1.2(S) Q2.2(S) R2.1 R3.1 R4.1 R7.1 R8.2 R13.1 R15.1 R32.1 R35.1 R38.1 R41.1 SW1.3 SW1.4 SW2.3 SW2.4 TP6.1 TP7.1 U1.1(GND) U1.26(GND) U1.35(GND) U1.48(GND) U1.49(GND) U1.50(GND) U1.51(GND) U1.52(GND) U1.53(GND) U1.54(GND) U1.55(GND) U1.56(GND) U1.57(GND) U1.58(GND) U1.59(GND) U1.60(GND) U2.B1(GND) U3.C3(PGND) U4.2(GND) U5.3(GND) U13.1(SDO/SA0) U13.2(SDx) U13.3(SCx) U13.6(GND) U13.7(GND) U14.A1(VSA) U15.2(GND) U16.3(GND) U17.2(GND) U17.5(EN#) U17.6(VBAT) U17.9(GND) U18.2(GND) U19.B1(GND) USB1.1(EP) USB1.2(EP) USB1.3(EP) USB1.4(EP) USB1.A1(GND) USB1.A12(GND) USB1.B1(GND) USB1.B12(GND)
VBAT: C8.2 CN3.6 SW1.1 SW2.1 TP1.1 U1.61(VBATS) U3.A3(VBAT)
VBAT_S: CN1.2 CN3.5 D18.1(C)
VBUS_5V: C3.2 C36.2 R6.2 R14.2 U3.A1(VBUS) U17.8(VOUT) U18.1(VIN) U18.3(EN)
VCC_3V3: C16.2 C17.2 CARD1.4(VDD) CN3.12 R42.2 R43.2 R46.2 R47.2 R48.2 R50.2
VCC_3V3_S: C10.2 CN3.11 TP3.1 U4.5(OUT)
VDD33_VOUT: R36.1 R51.2 U1.17(VDD33_VOUT2)
ADCIN: C27.2 U1.37(MIC_ADC_IN) U9.1(OUT)
CH_3V3: C11.1 C12.2 C37.2 U5.5(VCC) U5.8(V3) U18.5(OUT)
CH_RTS#: R58.1 U5.4(RTS#) U19.B2(EN)
CH_USB_DM: D4.2(A) U5.2(UD-) USB1.A7(DN1) USB1.B7(DN2)
CH_USB_DP: D3.2(A) U5.1(UD+) USB1.A6(DP1) USB1.B6(DP2)
CHG_INT: Q1.3(D) R5.1 U3.B2(INT)
DAC1N: C20.2 U1.34(AU_DAC1N_OUT)
DAC1P: C21.2 U1.33(AU_DAC1P_OUT)
GS_3V3: C29.2 C30.2 C31.2 C35.2 R44.2 R45.2 R52.2 R57.2 U13.5(VDDIO) U13.8(VDD) U13.12(CS) U14.B1(VDD) U16.1(VDD)
MIC_BIAS: R30.1 U1.36(MIC_BIAS)
MIC_GND: C26.1 C27.1 L4.2 U9.2(GND) U9.3(GND)
PA_00_LCD_QSPI_RSTB: FPC1.12 U1.47(PA00)
PA_01_LCD_BL_PWM: FPC1.2 U1.46(PA01)
PA_02_LCD_QSPI_TE: FPC1.11 U1.45(PA02)
PA_03_LCD_QSPI_CS: FPC1.15 U1.44(PA03)
PA_04_LCD_QSPI_CLK: R18.1 U1.43(PA04)
PA_05_LCD_QSPI_D0: R19.1 U1.42(PA05)
PA_06_LCD_QSPI_D1: R20.1 U1.41(PA06)
PA_07_LCD_QSPI_D2: R16.1 U1.40(PA07)
PA_08_LCD_QSPI_D3: R17.1 U1.39(PA08)
PA_09_TP_RSTN: D5.2 FPC1.21 U1.38(PA09)
PA_10_I2C0_SCL: CN3.30 R42.1 U1.32(PA10) U3.C2(SCL)
PA_11_I2C0_SDA: CN3.29 R43.1 U1.31(PA11) U3.C1(SDA)
PA_18_UART_RXD: R12.2 U1.30(PA18)
PA_19_UART_TXD: R11.2 U1.29(PA19)
PA_20_VIB_PWM: CN3.24 R37.1 U1.28(PA20)
PA_24_SPI1_DO: R22.1 U1.18(PA24)
PA_24_SPI1_DO_1: CARD1.3(CMD) CN3.20 D12.2(A) R22.2
PA_25_SPI1_DI: R24.1 U1.19(PA25)
PA_25_SPI1_DI_1: CARD1.7(DAT0) CN3.22 D10.2(A) R24.2
PA_26: R7.2 U1.20(PA26) U4.3(EN)
PA_27_SD_DET: R25.1 U1.21(PA27)
PA_27_SD_DET_1: CARD1.9(CD) CN3.23 D9.2 R25.2
PA_28_SPI1_CLK: R23.1 U1.22(PA28)
PA_28_SPI1_CLK_1: CARD1.5(CLK) CN3.21 D11.2(A) R23.2
PA_29_SPI1_CS: R21.1 U1.23(PA29)
PA_29_SPI1_CS_1: CARD1.2(CD/DAT3) CN3.19 D13.2(A) R21.2
PA_30: R54.1 U1.24(PA30)
PA_30_1: CN3.18 R41.2 R54.2 U15.3(EN)
PA_31: R57.1 U1.25(PA31) U13.4(INT1)
PA_32: CN3.17 R33.1 U1.16(PA32)
PA_33_TP_SDA: D7.2 FPC1.19 R47.1 U1.15(PA33)
PA_34_KEY1: CN3.26 D15.2 R34.2 SW1.2 TP8.1
PA_34_PWRKEY: Q1.1(G) R34.1 R35.2 U1.14(PA34)
PA_35_USB_DP: CN3.15 R56.1
PA_36_USB_DM: CN3.13 R55.1
PA_37_TP_SCL: D6.2 FPC1.20 R48.1 U1.11(PA37)
PA_38: R3.2 U1.10(PA38) U2.B2(EN)
PA_39_I2C1_SDA: CN3.14 R44.1 U1.9(PA39) U13.14(SDA) U14.B2(SDA) U16.6(SDA)
PA_40_I2C1_SCL: CN3.16 R45.1 U1.8(PA40) U13.13(SCL) U14.A2(SCL) U16.4(SCL)
PA_41_TP_INT: D8.2 FPC1.18 R46.1 U1.7(PA41)
PA_42: R29.2 U1.4(PA42) U6.1(CTRL)
PA_43: R31.1 R32.2 U1.3(PA43)
PA_43_KEY2: CN3.28 D14.2 R31.2 SW2.2
PA_44_VBUSDET: R14.1 R15.2 U1.2(PA44)
SPK_GND: C18.2 C19.1 C22.1 C24.1 C25.2 CN2.3 CN2.4 D1.1 D2.1 L3.2 R29.1 U6.7(GND)
SPK_OUTN: C22.2 C23.2 CN2.1 D1.2 L1.2
SPK_OUTP: C23.1 C25.1 CN2.2 D2.2 L2.2
UART_RXD: CN3.27 R12.1 TP5.1 U5.6(TXD)
UART_TXD: CN3.25 R11.1 TP4.1 U5.7(RXD)
USB_VBUS_5V: C2.2 CN3.1 CN3.2 D17.3(K) R2.2 TP2.1 U17.1(VIN) USB1.A4(VBUS) USB1.A9(VBUS) USB1.B4(VBUS) USB1.B9(VBUS)
VSYS: C4.2 CN3.8 R26.1 R58.2 R59.2 U2.A2(IN) U19.A2(IN)
VSYS_1: C5.2 C9.2 C33.2 R49.2 U2.A1(OUT) U4.1(VIN) U15.1(VIN)
VSYS_S: C6.2 CN3.7 U3.A2(VSYS)
$2N93902: C1.2 C38.2 R1.1 U1.27(VSYS)
$2N98864: R55.2 U1.12(PA36)
$2N98907: R56.2 U1.13(PA35)
$2N99775: R1.2 R59.1 U19.A1(OUT)
$14N33385: LED3.3(DI) R33.2
$14N36026: C28.2 D16.1(K) MT1.1 R36.2
$14N36235: Q2.1(G) R37.2 R38.2
$14N37208: D16.2(A) MT2.1 Q2.3(D)
$14N45728: LED3.4(VDD) R51.1
$14N55060: LED3.1(DO) TP9.1
$20N11228: C14.2 C15.2 FPC1.17 R50.1
$20N32162: FPC1.3 R16.2
$20N32208: FPC1.4 R17.2
$20N32248: FPC1.13 R18.2
$20N32291: FPC1.14 R19.2
$20N32377: FPC1.16 R20.2
$20N34914: C13.1 FPC1.1 R49.1
$29N5370: R8.1 USB1.A5(CC1)
$29N5384: R13.2 USB1.B5(CC2)
$31N8386: C18.1 C19.2 R26.2 U6.6(VCC)
$31N8678: L1.1 U6.5(VON)
$31N8717: L2.1 U6.8(VoP)
$31N9056: R27.2 U6.4(INN)
$31N9060: R28.2 U6.3(INP)
$31N9143: C20.1 R27.1
$31N9147: C21.1 R28.1
$31N9186: C24.2 U6.2(Bypass)
$31N10127: C26.2 R30.2 U9.4(VDD)
$32N38543: R4.2 U17.7(ILIM)
$32N45178: LED1.2(A) R6.1
$32N61845: R60.2 U3.B1(NTC)
$32N61853: C7.2 R5.2 R60.1 U3.B3(VDD)
$33N9450: C34.2 R52.1 U15.5(OUT)

Not connected (* = marked no-connect by the designer): CARD1 1(DAT2)* 8(DAT1)*; FPC1 5* 6* 7* 8* 9* 10*; U1 5(PA23)* 6(PA22)* 62(NC) 63(PA15)* 64(PA16)* 65(PA17)* 66(PA14)* 67(PA13)* 68(PA12)*; U4 4(NC)*; U13 9(INT2)* 10(NC)* 11(NC)*; U15 4(NC)*; U16 2(NC)* 5(INT)*; U17 3(NC)* 4(WRO#)*; U18 4(NC)*; USB1 A8(SUB1)* B8(SUB2)*

## Notes on the sheets
sheet 1
- SF32LB52-MOD-1
- 功耗测试点
- U19影响开机电压，最大压降10~20mV
sheet 2
- GPIO-30
- RGB
- KEY
- 工作电流Z最大36mA
- 静态电流最大0.6mA
- 5-6脚用来测试VBAT路径功耗，可以把电池和充电芯片与下游断开
- 7-8脚用来测试VSYS路径功耗，可以把VSYS与下游断开
- 11-12脚用来测试VCC_3V3路径功耗，可以把VCC_3V3与下游断开
- 正常运行时要求：5-6、7-8和11-12脚加跳线帽短接
- 低功耗设置：关闭VDD33_VOUT，P32设置为高阻输入
- 做子板扩展时，注意要把5-6、7-8和11-12脚做短接
- 起振电流 > 90mA
- 工作电流约 70mA
- 正极
- 负极
- 螺丝孔
- Vibrator
- 低功耗设置：关闭VDD33_VOUT，P20设置为高阻输入
sheet 3
- MicroSD Card
sheet 4
- LCM_QSPI_Panel
- 功耗测试点
- 功耗测试点
- TP
sheet 5
- 5V POWER IN
- Debug
- 静态电流4.5uA
- 电池供电时，CH340N不供电
- 总电流通过外挂USB电流测试工具测试
sheet 6
- AUDIO
- 功耗测试点
- 静态电流3mA，关闭电流0.1uA
- 下拉电阻静态电流0.6uA
sheet 7
- OVP & Charger & 电池
- VSYS 转 VSYS_1
- 兼容型号：SY5320-DBFRS
- 静态电流0.18uA，关闭电流0.05uA
- OVP
- 下拉电阻静态电流0.6uA
- 过30p接插件跳线帽和VSYS相连
- VSYS 转 VCC_3V3
- CHG
- 请勿更新PCB封装
- 静态电流4.5uA，关闭电流1uA
- 兼容型号：MP2662,ETA4662,SGM41562,AW32001E,SY6105
- 电池端待机电流（VBUS=0,VIO=VDD）= 9.5uA
- 下拉电阻静态电流0.6uA
- 电池端船运模式电流=0.5uA
- 充满电时，电池端电流=31uA
sheet 8
- A+G+M Sensor
- I2C 7'Addr = 0xD2
- 关闭电流(CS=0) = 3uA
- 最高工作电流 = 2mA
- I2C 7'Addr = 0x30
- 关闭电流 = 1uA
- 最高工作电流 = 4mA
- 功耗测试点
- 静态电流4.5uA，关闭电流1uA
- I2C 7'Addr = 0x29
- 待机电流 = 5uA
- 工作电流 = 220uA
- 下拉电阻静态电流0.6uA
